# EasyEDA Pro project SylvaEcho_rev0.3.epro

# Schematic sylvaecho

## Sheets
1 1 Power, MCU & LoRa Radio: Board Name: sylvaecho; Create Date: 2026-11-25; Page Name: 1 Power, MCU & LoRa Radio; Project Name: SylvaEcho: Solar LoRa Tree Sensor for Pollinators and Illegal Logging; Schematic Name: sylvaecho; Update Date: 2026-11-25; Company: SylvaEcho - open hardware; Page Size: A3; Version: Rev 0.3
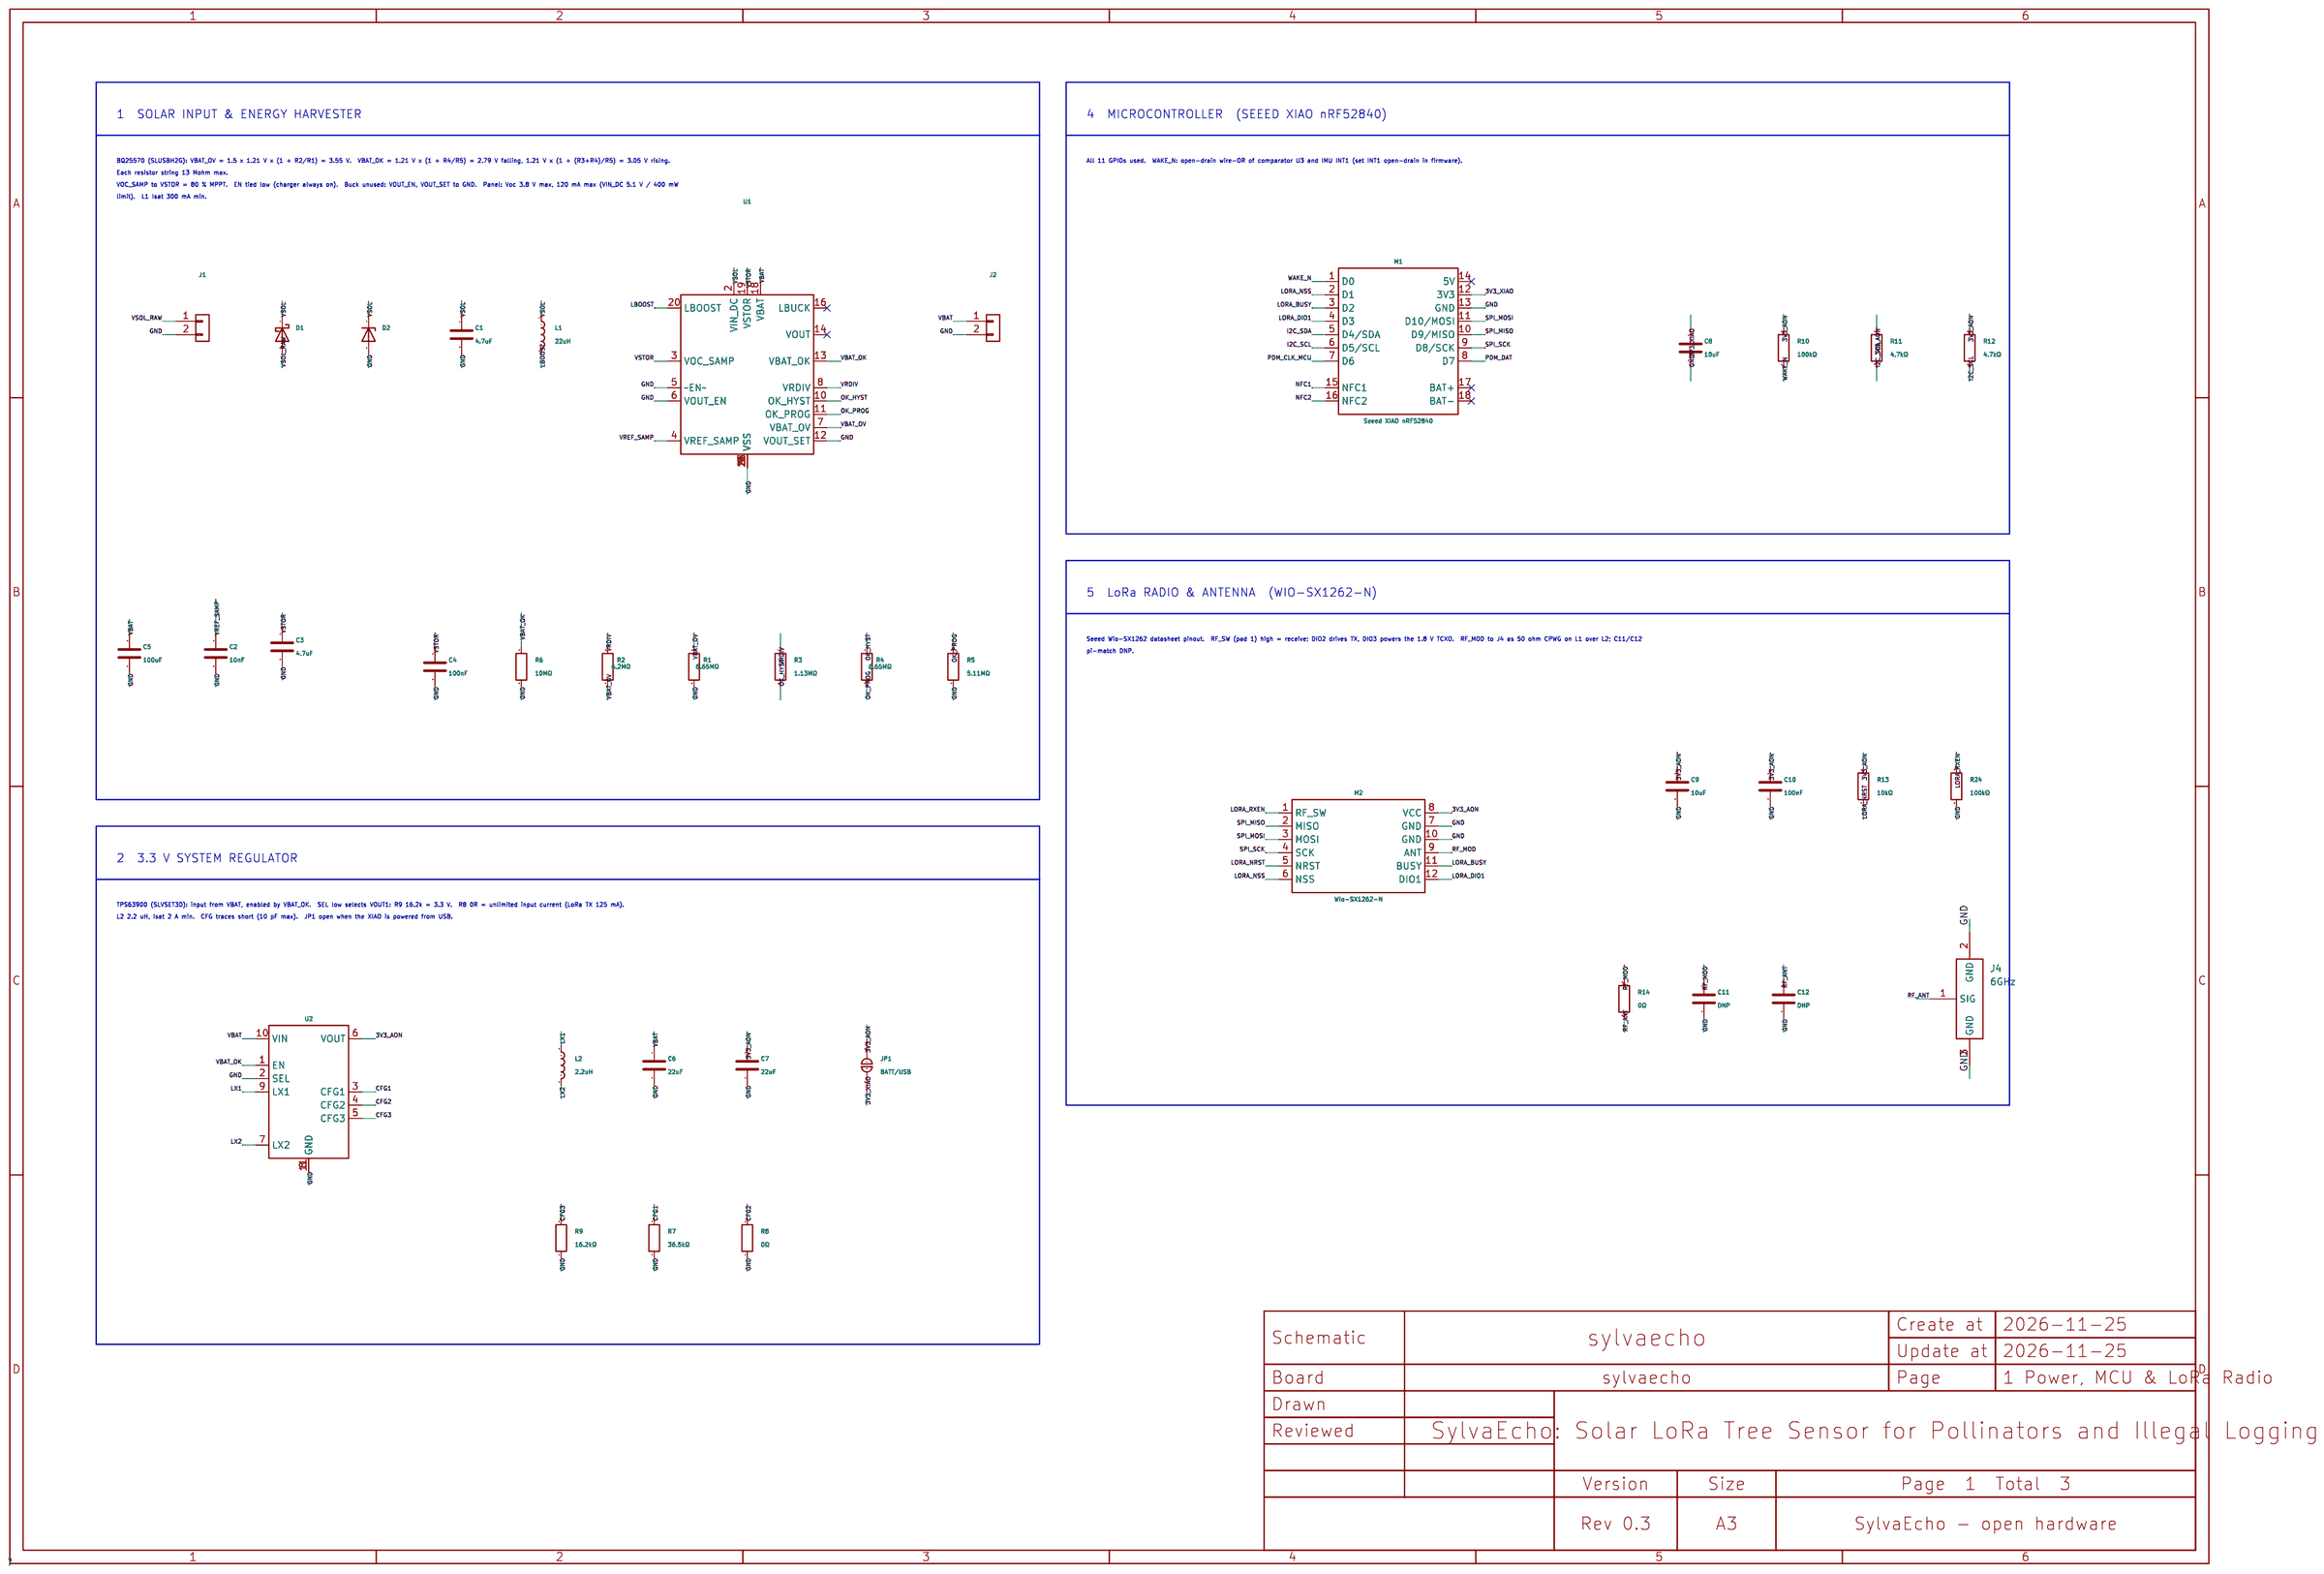
[diagram p0: 1 Power, MCU & LoRa Radio]
2 2 Sensors, Wake & IO: Page Name: 2 Sensors, Wake & IO
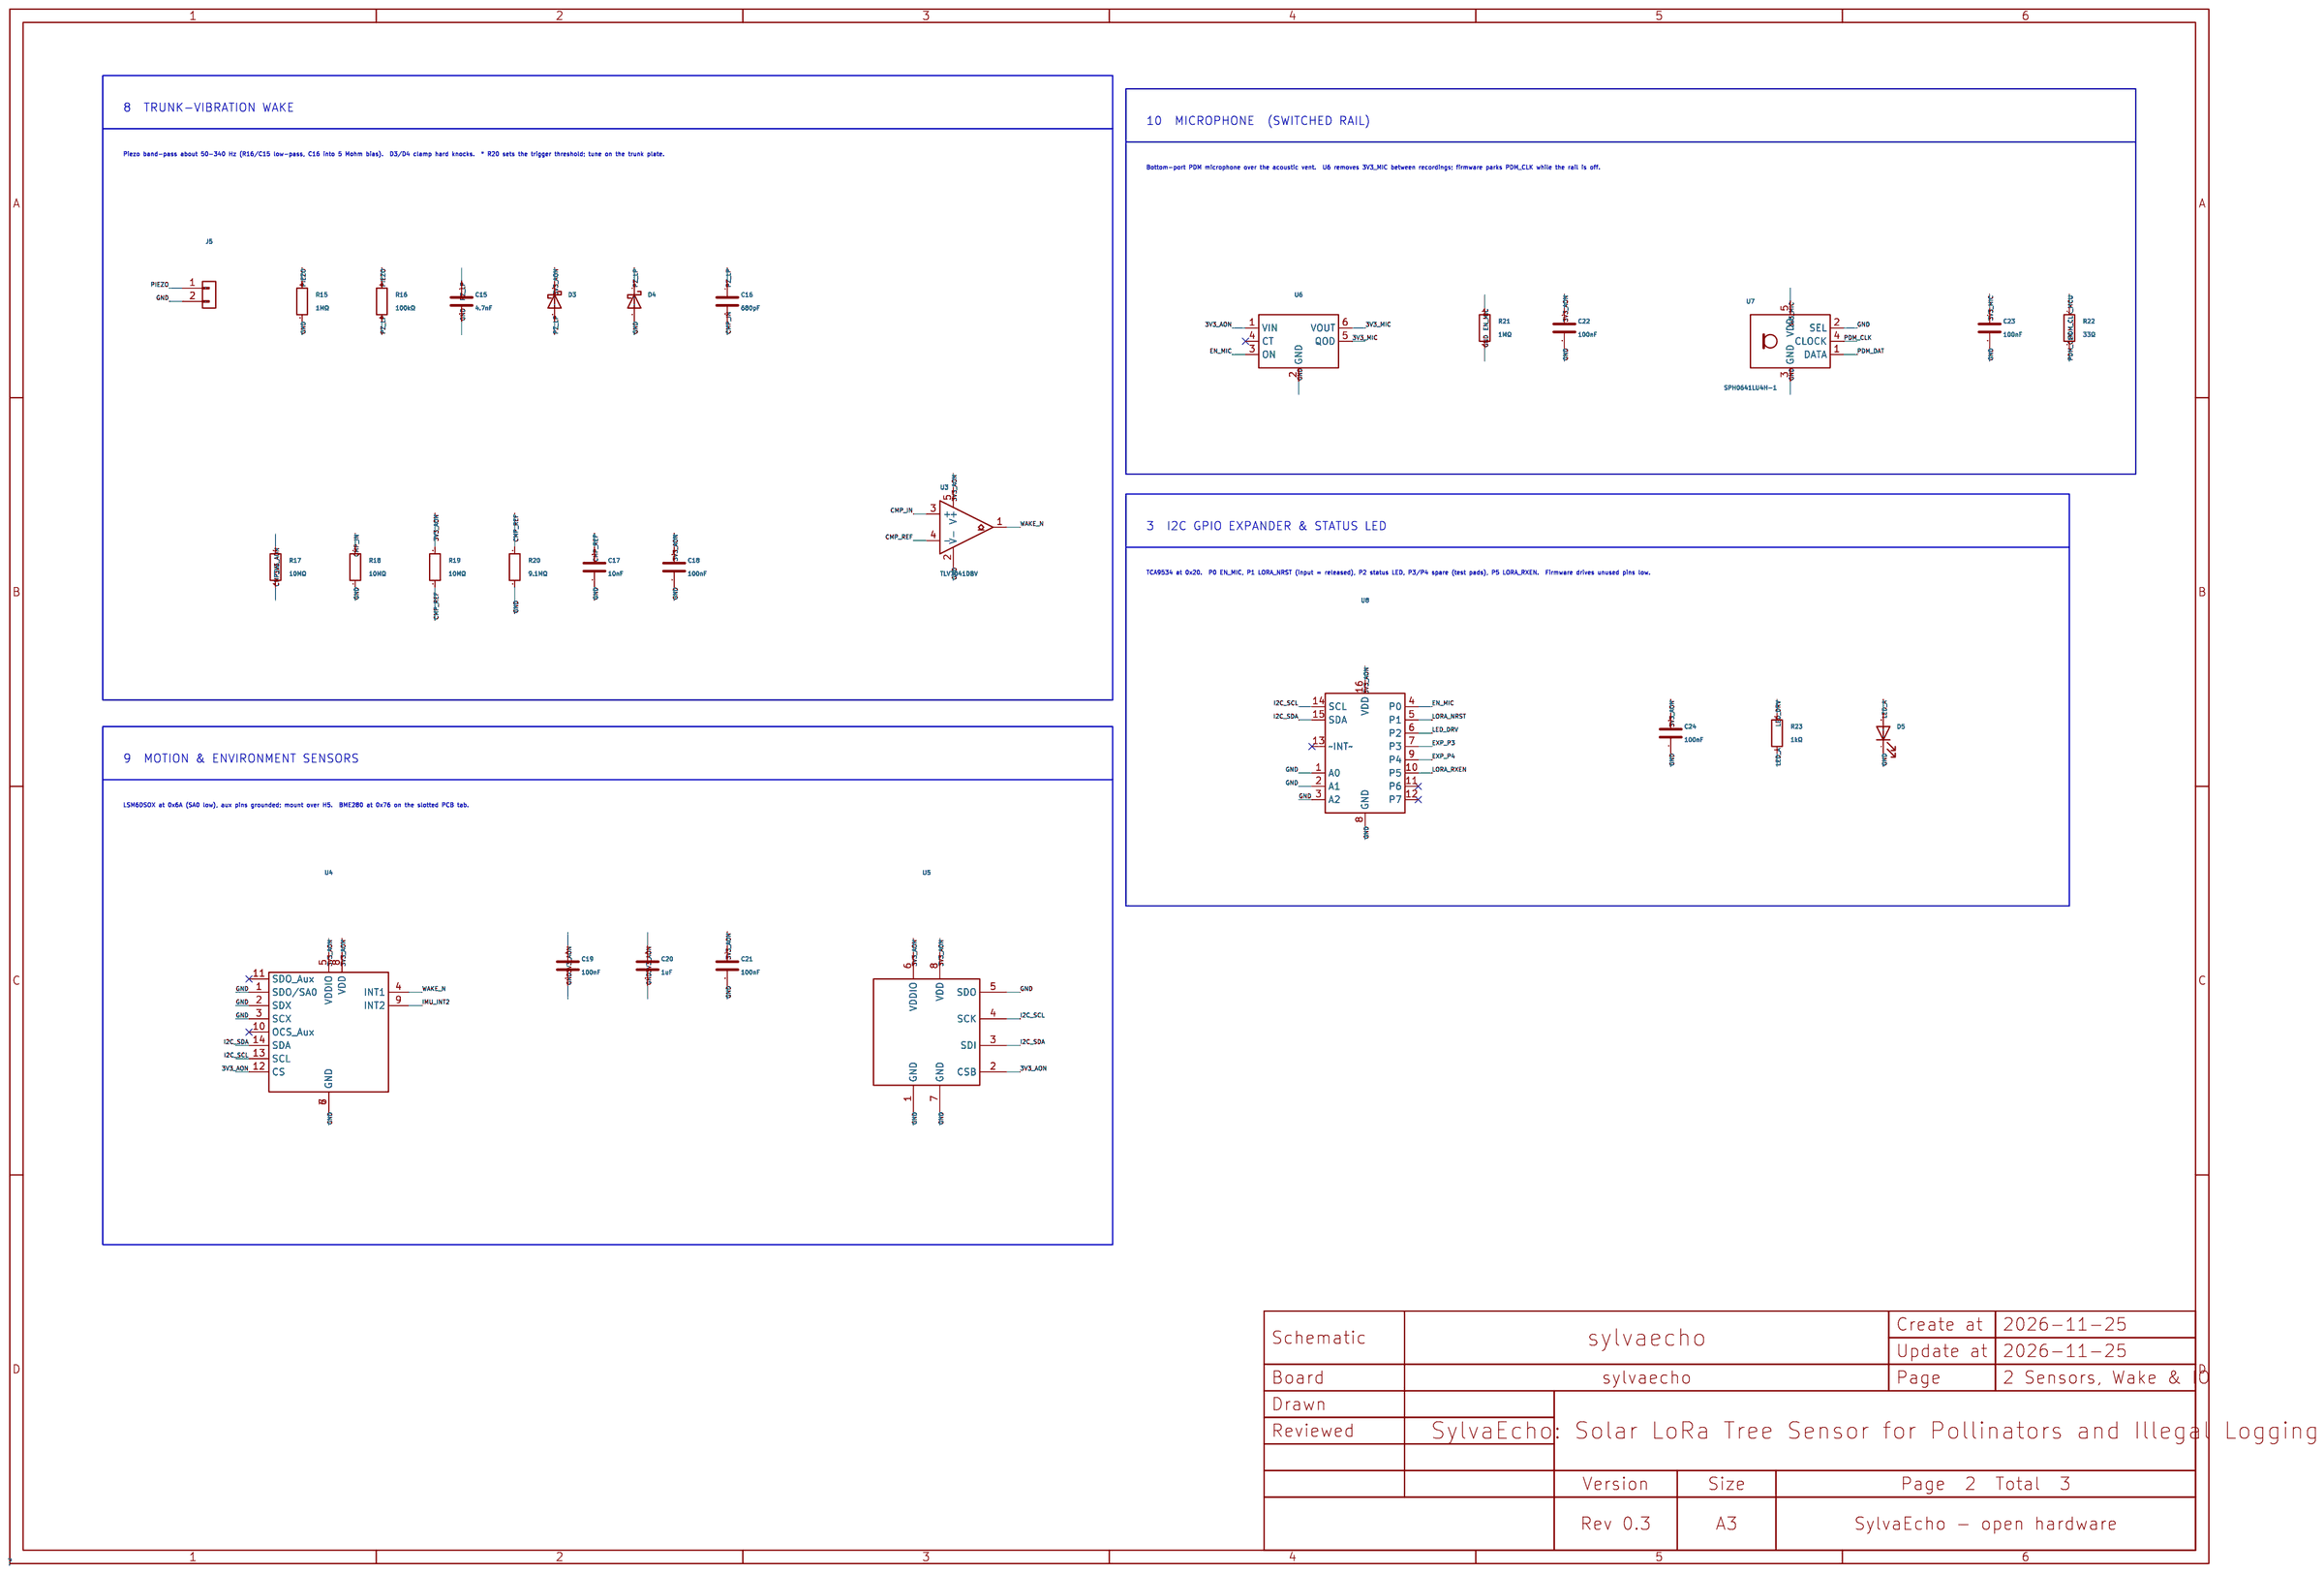
[diagram p1: 2 Sensors, Wake & IO]
3 3 NFC, Expansion & Test: Create Date: 2026-11-24; Page Name: 3 NFC, Expansion & Test; Update Date: 2026-11-24
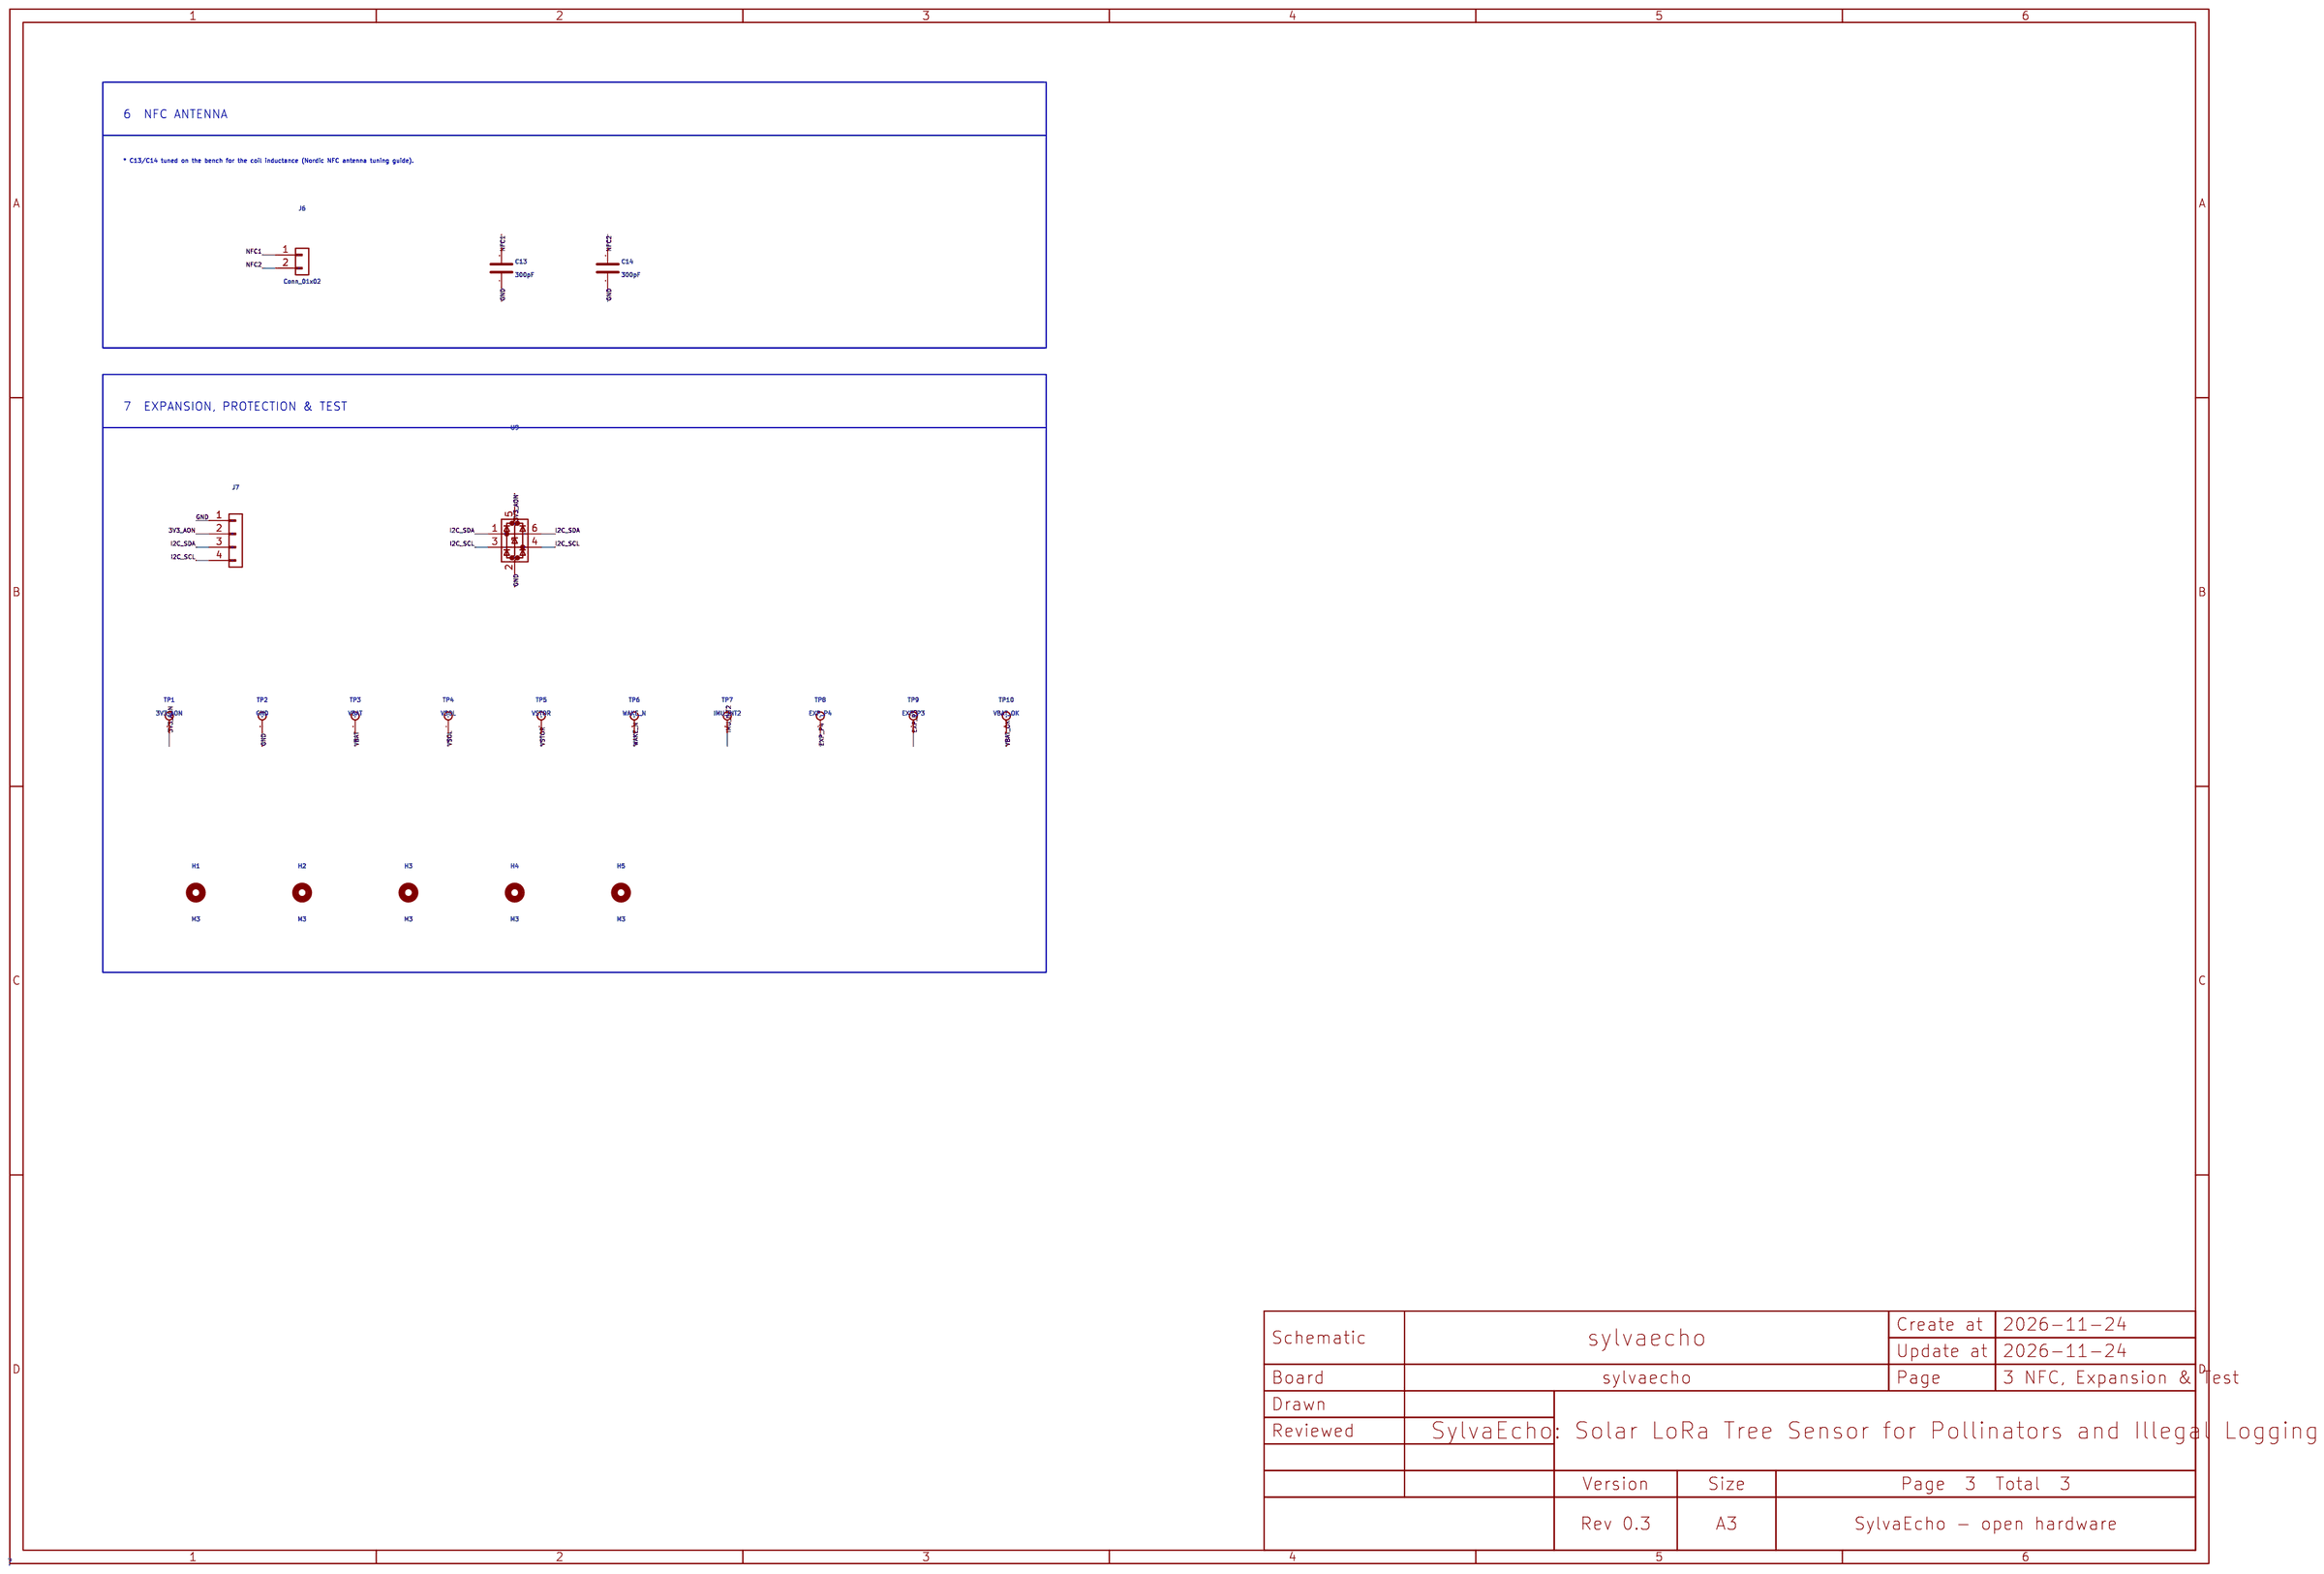
[diagram p2: 3 NFC, Expansion & Test]

## Parts
sheet 1 Power, MCU & LoRa Radio
C1  4.7uF
C2  10nF
C3  4.7uF
C4  100nF
C5  100uF
C6  22uF
C7  22uF
C8  10uF
C9  10uF
C10  100nF
C11  DNP
C12  DNP
D1  -
D2  -
J1  -
J2  -
J4  6GHz  [RF-SMD_FRF05002-JSS103M]
JP1  BATT/USB
L1  22uH
L2  2.2uH
M1  Seeed XIAO nRF52840
M2  Wio-SX1262-N
R1  6.65MΩ
R2  6.2MΩ
R3  1.13MΩ
R4  6.65MΩ
R5  5.11MΩ
R6  10MΩ
R7  36.5kΩ
R8  0Ω
R9  16.2kΩ
R10  100kΩ
R11  4.7kΩ
R12  4.7kΩ
R13  10kΩ
R14  0Ω
R24  100kΩ
U1  -
U2  -
sheet 2 Sensors, Wake & IO
C15  4.7nF
C16  680pF
C17  10nF
C18  100nF
C19  100nF
C20  1uF
C21  100nF
C22  100nF
C23  100nF
C24  100nF
D3  -
D4  -
D5  -
J5  -
R15  1MΩ
R16  100kΩ
R17  10MΩ
R18  10MΩ
R19  10MΩ
R20  9.1MΩ
R21  1MΩ
R22  33Ω
R23  1kΩ
U3  TLV7041DBV
U4  -
U5  -
U6  -
U7  SPH0641LU4H-1
U8  -
sheet 3 NFC, Expansion & Test
C13  300pF
C14  300pF
H1  M3
H2  M3
H3  M3
H4  M3
H5  M3
J6  Conn_01x02
J7  -
TP1  3V3_AON
TP2  GND
TP3  VBAT
TP4  VSOL
TP5  VSTOR
TP6  WAKE_N
TP7  IMU_INT2
TP8  EXP_P4
TP9  EXP_P3
TP10  VBAT_OK
U9  -

## Library data of the parts
C1 C3 = Device_C: Capacitance:4.7uF Tolerance:±10% Tolerance:±10% Voltage Rating:16V Temperature Coefficient:X5R
C2 = Device_C: Capacitance: Tolerance:±5% Tolerance:±5% Voltage Rated: Temperature Coefficient:
C4 C10 C18 C19 C21-C24 = Device_C: Capacitance:100nF Tolerance:±10% Tolerance:±10% Voltage Rating:16V Temperature Coefficient:X7R
C5 = Device_C: Capacitance:100uF Tolerance:±20% Tolerance:±20% Voltage Rating:6.3V Temperature Coefficient:X5R
C6 C7 = Device_C: Capacitance:22uF Tolerance:±20% Tolerance:±20% Voltage Rating:25V Temperature Coefficient:X5R
C8 C9 = Device_C: Capacitance:10uF Tolerance:±20% Tolerance:±20% Voltage Rating:6.3V Temperature Coefficient:X5R
C11 C12 = Device_C: LCSC Part Name: 680pF ±5% 50V; Supplier Part: C307451; Manufacturer: SAMSUNG(三星); Manufacturer Part: CL05C681JB5NNNC; Supplier Footprint: 0402; JLCPCB Part Class: Extended Part; Datasheet: https://item.szlcsc.com/datasheet/CL05C681JB5NNNC/291125.html; Supplier: LCSC; Tolerance: ±5%; Voltage Rating: 50V; Temperature Coefficient: C0G
D1 = Device_D_Schottky: Voltage - Forward(Vf@If):600mV@1A Voltage - DC Reverse(Vr):40V Current - Rectified:1A Non-Repetitive Peak Forward Surge Current:9A
D2 = Device_D_Zener: Diode Configuration:1 Independent Zener Voltage(Nom):4.7V Reverse Leakage Current (Ir):3uA Zener Voltage(Range):4.47V~4.94V Zener Voltage(Range):4.47V~4.94V Pd - Power Dissipation:350mW Impedance(Zzt):80Ω Impedance(Zzk):500Ω Operating Junction Temperature
J1 J2 J5 = Connector_Generic_Conn_01x02: Pins Structure:1x2P Pitch:2mm Mounting Type:Surface Mount, Right Angle Reference Series:PH Number of Pins:2P Number of Rows:1 Number of PINs Per Row:2 Row Spacing:- Current Rating:2A Contact Material:Copper alloy Contact Plating:Tin Operating Temperature:
J4 = U.FL-R-SMT-1(80)_C88374: Connector Type:Board Side Interface:Inner pin Number of Ports:1 Interface Diameter:2mm Interface Length/Height:1.25mm Frequency:6GHz RF Series:IPEX Impedance:50Ω Style:- Operating Temperature Range:-40℃~+90℃ Operating Temperature Range:-40℃~+90℃; LCSC Part Name: IPEX 内针; Supplier Part: C88374; Manufacturer: HRS(广濑); Manufacturer Part: U.FL-R-SMT-1(80); Supplier Footprint: SMD; JLCPCB Part Class: Extended Part; Datasheet: https://item.szlcsc.com/datasheet/U.FL-R-SMT-1(80)/89553.html; Supplier: LCSC; Connector Type: Board Side; Interface: Inner pin; Number of Ports: 1; Interface Diameter: 2mm; Interface Length/Height: 1.25mm; RF Series: IPEX; Impedance: 50Ω; Operating Temperature Range: -40℃~+90℃; PCB Layer: Default
JP1 = Jumper_SolderJumper_2_Open
L1 = Device_L: Inductance:22uH Tolerance:±20% Tolerance:±20% Current Rating:950mA Current - Saturation(Isat):880mA DC Resistance(DCR):350mΩ Type:Magnetic Shielded Inductor Magnetic Core:Ferrite Application Grade:Consumer grade
L2 = Device_L: Inductance:2.2uH Tolerance:±20% Tolerance:±20% Current Rating:2.6A Current - Saturation(Isat):3.2A Type:Magnetic Shielded Inductor Application Grade:Consumer grade
M1 = SylvaEcho_XIAO_nRF52840
M2 = SylvaEcho_Wio_SX1262_SMT
R1 R4 = Device_R: Type:Thick Film Resistors Resistance: Tolerance:±1% Tolerance:±1% Power(Watts): Overload Voltage (Max): Temperature Coefficient:±100ppm/℃ Temperature Coefficient:±100ppm/℃ Operating Temperature Range:-55℃~+155℃ Operating Temperature Range:-55℃~+155℃; LCSC Part Name: 厚膜电阻 6.65MΩ ±1% 62.5mW; Supplier Part: C620472; Manufacturer: UNI-ROYAL(厚声); Manufacturer Part: 0402WGF6654TCE; Supplier Footprint: 0402; JLCPCB Part Class: Extended Part; Datasheet: https://atta.szlcsc.com/upload/public/pdf/source/20200715/C477773_612125B6565291B8A455FD85854881BB.pdf; Supplier: LCSC; Type: Thick Film Resistors; Tolerance: ±1%; Temperature Coefficient: ±100ppm/℃; Operating Temperature Range: -55℃~+155℃; PCB Layer: Default
R2 = Device_R: Type:Thick Film Resistor Resistance:6.34MΩ Tolerance:±1% Tolerance:±1% Power(Watts):62.5mW Voltage-Supply(Max):50V Temperature Coefficient:±100ppm/℃ Temperature Coefficient:±100ppm/℃ Operating Temperature:-55℃~+155℃ Operating Temperature:-55℃~+155℃; LCSC Part Name: 厚膜电阻 6.34MΩ ±1% 62.5mW; Supplier Part: C166436; Manufacturer: RALEC(旺诠); Manufacturer Part: RTT026204FTH; Supplier Footprint: 0402; JLCPCB Part Class: Extended Part; Datasheet: https://item.szlcsc.com/datasheet/RC0402FR-076M34L/484702.html; Supplier: LCSC; Type: Thick Film Resistor; Tolerance: ±1%; Power(Watts): 62.5mW; Voltage-Supply(Max): 50V; Temperature Coefficient: ±100ppm/℃; Operating Temperature: -55℃~+155℃; PCB Layer: Default
R3 = Device_R: Type:Thick Film Resistor Resistance:1.13MΩ Tolerance:±1% Tolerance:±1% Power(Watts):62.5mW Voltage-Supply(Max):50V Temperature Coefficient:±100ppm/℃ Temperature Coefficient:±100ppm/℃ Operating Temperature:-55℃~+155℃ Operating Temperature:-55℃~+155℃
R5 R20 = Device_R: Type:Thick Film Resistors Resistance: Tolerance:±1% Tolerance:±1% Power(Watts): Overload Voltage (Max): Temperature Coefficient:±100ppm/℃ Temperature Coefficient:±100ppm/℃ Operating Temperature Range:-55℃~+155℃ Operating Temperature Range:-55℃~+155℃
R6 R17-R19 = Device_R: Type:Thick Film Resistor Resistance:10MΩ Tolerance:±1% Tolerance:±1% Power(Watts):62.5mW Voltage-Supply(Max):50V Temperature Coefficient:±200ppm/℃ Temperature Coefficient:±200ppm/℃ Operating Temperature:-55℃~+155℃ Operating Temperature:-55℃~+155℃
R7 = Device_R: Type:Thick Film Resistor Resistance:36.5kΩ Tolerance:±1% Tolerance:±1% Power(Watts):62.5mW Voltage-Supply(Max):50V Temperature Coefficient:±100ppm/℃ Temperature Coefficient:±100ppm/℃ Operating Temperature:-55℃~+155℃ Operating Temperature:-55℃~+155℃
R8 R14 = Device_R: Type:Thick Film Resistor Resistance:0Ω Tolerance:±1% Tolerance:±1% Power(Watts):62.5mW Voltage-Supply(Max):50V Temperature Coefficient:±800ppm/℃ Temperature Coefficient:±800ppm/℃ Operating Temperature:-55℃~+155℃ Operating Temperature:-55℃~+155℃
R9 = Device_R: Type:Thick Film Resistor Resistance:16.2kΩ Tolerance:±1% Tolerance:±1% Power(Watts):62.5mW Voltage-Supply(Max):50V Temperature Coefficient:±100ppm/℃ Temperature Coefficient:±100ppm/℃ Operating Temperature:-55℃~+155℃ Operating Temperature:-55℃~+155℃
R10 R16 R24 = Device_R: Type:Thick Film Resistor Resistance:100kΩ Tolerance:±1% Tolerance:±1% Power(Watts):62.5mW Voltage-Supply(Max):50V Temperature Coefficient:±100ppm/℃ Temperature Coefficient:±100ppm/℃ Operating Temperature:-55℃~+155℃ Operating Temperature:-55℃~+155℃
R11 R12 = Device_R: Type:Thick Film Resistor Resistance:4.7kΩ Tolerance:±1% Tolerance:±1% Power(Watts):62.5mW Voltage-Supply(Max):50V Temperature Coefficient:±100ppm/℃ Temperature Coefficient:±100ppm/℃ Operating Temperature:-55℃~+155℃ Operating Temperature:-55℃~+155℃
R13 = Device_R: Type:Thick Film Resistor Resistance:10kΩ Tolerance:±1% Tolerance:±1% Power(Watts):62.5mW Voltage-Supply(Max):50V Temperature Coefficient:±100ppm/℃ Temperature Coefficient:±100ppm/℃ Operating Temperature:-55℃~+155℃ Operating Temperature:-55℃~+155℃
U1 = Battery_Management_BQ25570: The Chip Type:Protection IC；Charging IC Voltage - Supply:2V~5.5V Voltage - Supply:2V~5.5V Charge Current - Max:285mA End-Off Voltage:1.95V Type of Battery:Supercapacitor；Lithium Battery Operating Temperature:-40℃~+125℃ Operating Temperature:-40℃~+125℃ Bat
U2 = Regulator_Switching_TPS63900: Function:Buck-Boost Voltage - Supply:1.8V~5.5V Voltage - Supply:1.8V~5.5V Output Voltage:1.8V~5V Output Voltage:1.8V~5V Output Current:400mA Frequency - Switching:- Frequency - Switching:- Operating Temperature:-40℃~+125℃@(TJ) Operating Temperature:-40℃~+
C15 = Device_C: Capacitance:4.7nF Tolerance:±10% Tolerance:±10% Voltage Rating:50V Temperature Coefficient:X7R
C16 = Device_C: Capacitance:680pF Tolerance:±5% Tolerance:±5% Voltage Rating:50V Temperature Coefficient:C0G
C17 = Device_C: Capacitance:10nF Tolerance:±10% Tolerance:±10% Voltage Rating:50V Temperature Coefficient:X7R
C20 = Device_C: Capacitance:1uF Tolerance:±10% Tolerance:±10% Voltage Rating:25V Temperature Coefficient:X5R
D3 D4 = Device_D_Schottky: Diode Configuration:1 Independent Voltage - Forward(Vf@If):1V@100mA Voltage - DC Reverse(Vr):30V Current - Rectified:100mA Reverse Leakage Current (Ir):2uA@25V Operating Junction Temperature Range:-65℃~+150℃ Operating Junction Temperature Range:-65℃~+150℃
D5 = Device_LED: Lamp Holder Type:1.6mm x 0.8mm square LED Illumination Color:Emerald Green Voltage - Forward(Vf):3.1V Voltage - Forward(Vf):3.1V Power(Watts):100mW Forward Current:5mA Wavelength - Dominant:513nm~528nm Wavelength - Dominant:513nm~528nm Peak Wavelength:525
R15 R21 = Device_R: Type:Thick Film Resistor Resistance:1MΩ Tolerance:±1% Tolerance:±1% Power(Watts):62.5mW Voltage-Supply(Max):50V Temperature Coefficient:±100ppm/℃ Temperature Coefficient:±100ppm/℃ Operating Temperature:-55℃~+155℃ Operating Temperature:-55℃~+155℃
R22 = Device_R: Type:Thick Film Resistor Resistance:33Ω Tolerance:±1% Tolerance:±1% Power(Watts):62.5mW Voltage-Supply(Max):50V Temperature Coefficient:±100ppm/℃ Temperature Coefficient:±100ppm/℃ Operating Temperature:-55℃~+155℃ Operating Temperature:-55℃~+155℃
R23 = Device_R: Type:Thick Film Resistor Resistance:1kΩ Tolerance:±1% Tolerance:±1% Power(Watts):62.5mW Voltage-Supply(Max):50V Temperature Coefficient:±100ppm/℃ Temperature Coefficient:±100ppm/℃ Operating Temperature:-55℃~+155℃ Operating Temperature:-55℃~+155℃
U3 = Comparator_TLV7041DBV: Number of Channels:Single-channel Vos - Input Offset Voltage:100uV Ib - Input Bias Current:2pA Propagation Delay Time:3us Input Hysteresis Voltage (Vhys):7mV Common Mode Rejection Ratio(CMRR):73dB Output Type:Open-drain Output Mode:- Rail to Rail:Rail-to-; UserDocLink: https://www.ti.com/lit/ds/symlink/tlv7041.pdf; LCSC Part Name: 小尺寸、毫微功耗、低电压比较器; Supplier Part: C3659207; Manufacturer: TI(德州仪器); Manufacturer Part: TLV7041QDBVRQ1; Supplier Footprint: SOT-23-5; JLCPCB Part Class: Extended Part; Datasheet: https://www.ti.com/cn/lit/ds/symlink/tlv7042.pdf; Supplier: LCSC; Number of Channels: Single-channel; Vos - Input Offset Voltage: 100uV; Ib - Input Bias Current: 2pA; Propagation Delay Time: 3us; Input Hysteresis Voltage (Vhys): 7mV; Common Mode Rejection Ratio(CMRR): 73dB; Output Type: Open-drain; Rail to Rail: Rail-to-rail input; Quiescent Current: 315nA; Operating Temperature: -40℃~+125℃; Maximum Power Supply Range (Vdd-Vss): 7V; Single Supply: 1.6V~6.5V; Input Offset Current(Ios): 1pA; Response Time (tr): 4.5ns; PCB Layer: Default
U4 = Sensor_Motion_LSM6DSM: Accelerometer Sensing Axis:X,Y,Z Acceleration Measurement Range (MAX):±16g Acceleration Measurement Range (MAX):±16g Gyroscope Sensing Axis:X,Y,Z Gyroscope Measurement Range (MAX):±2000dps Gyroscope Measurement Range (MAX):±2000dps Sensor Type:IMU (accele
U5 = Sensor_BME280: Temperature Range:-40℃~+85℃ Temperature Range:-40℃~+85℃ Humidity:0%RH~100%RH Humidity:0%RH~100%RH Interface:I2C；SPI Voltage - Supply:1.71V~3.6V Voltage - Supply:1.71V~3.6V Current - Supply:1.8uA Humidity Tolerance:±3%RH Humidity Tolerance:±3%RH Temperatur
U6 = Power_Management_TPS22917DBV: Type:Load Switch Number of Channels:1 Control Input Logic:Active High Voltage - Supply:0V~5.5V Voltage - Supply:0V~5.5V Maximum Continuous Current:2A RDS(on):80mΩ Features:Soft-start；Reverse current blocking；Output discharge function Operating Temperature
U7 = Sensor_Audio_SPH0641LU4H-1: Manufacturer: Knowles(楼氏); Supplier: LCSC; Supplier Part: C2879853; PCB Layer: Default
U8 = Interface_Expansion_TCA9534: Interface:I2C Number of I/O:8 Interrupt Output:Interrupt Output Output Type:Push-Pull Current - Output Low(IOL):25mA Current - Output High(IOH):10mA Clock Frequency:400kHz Number of Supporting Devices:8 Quiescent Supply Current:1.5uA Output Logic Level -
C13 C14 = Device_C: Capacitance:300pF Tolerance:±5% Tolerance:±5% Voltage Rating:50V Temperature Coefficient:C0G; PCB Layer: Default; LCSC Part Name: 300pF ±5% 50V; Supplier Part: C162095; Manufacturer: muRata(村田); Manufacturer Part: GRM1555C1H301JA01D; Supplier Footprint: 0402; JLCPCB Part Class: Extended Part; Datasheet: https://item.szlcsc.com/datasheet/GRM1555C1H301JA01D/173476.html; Supplier: LCSC; Tolerance: ±5%; Voltage Rating: 50V; Temperature Coefficient: C0G
H1-H5 = Mechanical_MountingHole
J6 = Connector_Generic_Conn_01x02: Pins Structure:1x2P Pitch:2mm Mounting Type:Surface Mount, Right Angle Reference Series:PH Number of Pins:2P Number of Rows:1 Number of PINs Per Row:2 Row Spacing:- Current Rating:2A Contact Material:Copper alloy Contact Plating:Tin Operating Temperature:; PCB Layer: Default; LCSC Part Name: 1x2P 间距:2mm 卧贴 系列:PH; Supplier Part: C295747; Manufacturer: JST; Manufacturer Part: S2B-PH-SM4-TB(LF)(SN); Supplier Footprint: SMD,P=2mm,卧贴; JLCPCB Part Class: Extended Part; Datasheet: https://item.szlcsc.com/datasheet/S2B-PH-SM4-TB(LF)(SN)/280164.html; Supplier: LCSC; Pins Structure: 1x2P; Pitch: 2mm; Mounting Type: Surface Mount, Right Angle; Reference Series: PH; Number of Pins: 2P; Number of Rows: 1; Number of PINs Per Row: 2; Current Rating: 2A; Contact Material: Copper alloy; Contact Plating: Tin; Operating Temperature: -25℃~+85℃; Voltage Rating: 100V; Plastic Material: PA; Flame Retardant Rating: UL94V-0; Supplementary Features: Auxiliary Solder Pin; Color: Beige; Z-Height of the Board: 5.5mm; X-Length of Bottom Edge on Board (Spacing Line): 7.9mm; Y-Width of Bottom Edge on Board: 8.6mm
J7 = Connector_Generic_Conn_01x04: Pins Structure:1x4P Pitch:1mm Mounting Type:Surface Mount, Right Angle Reference Series:SH Number of Pins:4P Number of Rows:1 Number of PINs Per Row:4 Row Spacing:- Current Rating:1A Contact Material:Copper alloy Contact Plating:Tin Operating Temperature:
TP1-TP10 = Connector_TestPoint
U9 = Power_Protection_USBLC6-2SC6: Polarity:Unidirectional Reverse Stand-Off Voltage (Vrwm):5V Clamping Voltage:12V Peak Pulse Current (Ipp):6A Peak Pulse Power Dissipation (Ppp):150W Voltage - Breakdown:6V Reverse Leakage Current (Ir):80nA Number of Channels:2 Operating Temperature:-55℃~+

## Nets
3V3_AON: C7.1 C9.1 C10.1 C18.1 C19.1 C20.1 C21.1 C22.1 C24.1 D3.1(K) J7.2(Pin) JP1.1(A) M2.8(VCC) R10.1 R11.1 R12.1 R13.1 R17.1 R19.1 TP1.1 U2.6(VOUT) U3.5(V+) U4.5(VDDIO) U4.8(VDD) U4.12(CS) U5.2(CSB) U5.6(VDDIO) U5.8(VDD) U6.1(VIN) U8.16(VDD) U9.5(VBUS)
3V3_MIC: C23.1 U6.5(QOD) U6.6(VOUT) U7.5(VDD)
3V3_XIAO: C8.1 JP1.2(B) M1.12(3V3)
GND: C1.2 C2.2 C3.2 C4.2 C5.2 C6.2 C7.2 C8.2 C9.2 C10.2 C11.2 C12.2 C13.2 C14.2 C15.2 C17.2 C18.2 C19.2 C20.2 C21.2 C22.2 C23.2 C24.2 D2.2(A) D4.2(A) D5.1(K) J1.2(Pin) J2.2(Pin) J4.2(GND) J4.3(GND) J5.2(Pin) J7.1(Pin) M1.13(GND) M2.7(GND) M2.10(GND) R1.2 R5.2 R6.2 R7.2 R8.2 R9.2 R15.2 R18.2 R20.2 R21.2 R24.2 TP2.1 U1.1(VSS) U1.5(~EN~) U1.6(VOUT_EN) U1.9(VSS) U1.12(VOUT_SET) U1.15(VSS) U1.17(VSS) U1.21(VSS) U2.2(SEL) U2.8(GND) U2.11(GND) U3.2(V-) U4.1(SDO/SA0) U4.2(SDX) U4.3(SCX) U4.6(GND) U4.7(GND) U5.1(GND) U5.5(SDO) U5.7(GND) U6.2(GND) U7.2(SEL) U7.3(GND) U8.1(A0) U8.2(A1) U8.3(A2) U8.8(GND) U9.2(GND)
VBAT: C5.1 C6.1 J2.1(Pin) TP3.1 U1.18(VBAT) U2.10(VIN)
VBAT_OK: R6.1 TP10.1 U1.13(VBAT_OK) U2.1(EN)
VBAT_OV: R1.1 R2.2 U1.7(VBAT_OV)
CFG1: R7.1 U2.3(CFG1)
CFG2: R8.1 U2.4(CFG2)
CFG3: R9.1 U2.5(CFG3)
CMP_IN: C16.2 R17.2 R18.1 U3.3(+)
CMP_REF: C17.1 R19.2 R20.1 U3.4(-)
EN_MIC: R21.1 U6.3(ON) U8.4(P0)
EXP_P3: TP9.1 U8.7(P3)
EXP_P4: TP8.1 U8.9(P4)
I2C_SCL: J7.4(Pin) M1.6(D5/SCL) R12.2 U4.13(SCL) U5.4(SCK) U8.14(SCL) U9.3(I/O2) U9.4(I/O2)
I2C_SDA: J7.3(Pin) M1.5(D4/SDA) R11.2 U4.14(SDA) U5.3(SDI) U8.15(SDA) U9.1(I/O1) U9.6(I/O1)
IMU_INT2: TP7.1 U4.9(INT2)
LBOOST: L1.2 U1.20(LBOOST)
LED_A: D5.2(A) R23.2
LED_DRV: R23.1 U8.6(P2)
LORA_BUSY: M1.3(D2) M2.11(BUSY)
LORA_DIO1: M1.4(D3) M2.12(DIO1)
LORA_NRST: M2.5(NRST) R13.2 U8.5(P1)
LORA_NSS: M1.2(D1) M2.6(NSS)
LORA_RXEN: M2.1(RF_SW) R24.1 U8.10(P5)
LX1: L2.1 U2.9(LX1)
LX2: L2.2 U2.7(LX2)
NFC1: C13.1 J6.1(Pin) M1.15(NFC1)
NFC2: C14.1 J6.2(Pin) M1.16(NFC2)
OK_HYST: R3.2 R4.1 U1.10(OK_HYST)
OK_PROG: R4.2 R5.1 U1.11(OK_PROG)
PDM_CLK: R22.2 U7.4(CLOCK)
PDM_CLK_MCU: M1.7(D6) R22.1
PDM_DAT: M1.8(D7) U7.1(DATA)
PIEZO: J5.1(Pin) R15.1 R16.1
PZ_LP: C15.1 C16.1 D3.2(A) D4.1(K) R16.2
RF_ANT: C12.1 J4.1(SIG) R14.2
RF_MOD: C11.1 M2.9(ANT) R14.1
SPI_MISO: M1.10(D9/MISO) M2.2(MISO)
SPI_MOSI: M1.11(D10/MOSI) M2.3(MOSI)
SPI_SCK: M1.9(D8/SCK) M2.4(SCK)
VRDIV: R2.1 R3.1 U1.8(VRDIV)
VREF_SAMP: C2.1 U1.4(VREF_SAMP)
VSOL: C1.1 D1.1(K) D2.1(K) L1.1 TP4.1 U1.2(VIN_DC)
VSOL_RAW: D1.2(A) J1.1(Pin)
VSTOR: C3.1 C4.1 TP5.1 U1.3(VOC_SAMP) U1.19(VSTOR)
WAKE_N: M1.1(D0) R10.2 TP6.1 U3.1 U4.4(INT1)

Not connected (* = marked no-connect by the designer): M1 14(5V)* 17(BAT+)* 18(BAT-)*; U1 14(VOUT)* 16(LBUCK)*; U4 10(OCS_Aux)* 11(SDO_Aux)*; U6 4(CT)*; U8 11(P6)* 12(P7)* 13(~INT~)*

## Notes on the sheets
sheet 1
- 1  SOLAR INPUT & ENERGY HARVESTER
- 4  MICROCONTROLLER  (SEEED XIAO nRF52840)
- BQ25570 (SLUSBH2G): VBAT_OV = 1.5 x 1.21 V x (1 + R2/R1) = 3.55 V.  VBAT_OK = 1.21 V x (1 + R4/R5) = 2.79 V falling, 1.21 V x (1 + (R3+R4)/R5) = 3.05 V rising.
- Each resistor string 13 Mohm max.
- All 11 GPIOs used.  WAKE_N: open-drain wire-OR of comparator U3 and IMU INT1 (set INT1 open-drain in firmware).
- VOC_SAMP to VSTOR = 80 % MPPT.  EN tied low (charger always on).  Buck unused: VOUT_EN, VOUT_SET to GND.  Panel: Voc 3.8 V max, 120 mA max (VIN_DC 5.1 V / 400 mW
- limit).  L1 Isat 300 mA min.
- 5  LoRa RADIO & ANTENNA  (WIO-SX1262-N)
- Seeed Wio-SX1262 datasheet pinout.  RF_SW (pad 1) high = receive; DIO2 drives TX, DIO3 powers the 1.8 V TCXO.  RF_MOD to J4 as 50 ohm CPWG on L1 over L2; C11/C12
- pi-match DNP.
- 2  3.3 V SYSTEM REGULATOR
- TPS63900 (SLVSET3D): input from VBAT, enabled by VBAT_OK.  SEL low selects VOUT1: R9 16.2k = 3.3 V.  R8 0R = unlimited input current (LoRa TX 125 mA).
- L2 2.2 uH, Isat 2 A min.  CFG traces short (10 pF max).  JP1 open when the XIAO is powered from USB.
sheet 2
- 8  TRUNK-VIBRATION WAKE
- 10  MICROPHONE  (SWITCHED RAIL)
- Piezo band-pass about 50-340 Hz (R16/C15 low-pass, C16 into 5 Mohm bias).  D3/D4 clamp hard knocks.  * R20 sets the trigger threshold; tune on the trunk plate.
- Bottom-port PDM microphone over the acoustic vent.  U6 removes 3V3_MIC between recordings; firmware parks PDM_CLK while the rail is off.
- 3  I2C GPIO EXPANDER & STATUS LED
- TCA9534 at 0x20.  P0 EN_MIC, P1 LORA_NRST (input = released), P2 status LED, P3/P4 spare (test pads), P5 LORA_RXEN.  Firmware drives unused pins low.
- 9  MOTION & ENVIRONMENT SENSORS
- LSM6DSOX at 0x6A (SA0 low), aux pins grounded; mount over H5.  BME280 at 0x76 on the slotted PCB tab.
sheet 3
- 6  NFC ANTENNA
- * C13/C14 tuned on the bench for the coil inductance (Nordic NFC antenna tuning guide).
- 7  EXPANSION, PROTECTION & TEST

# Board PCB2
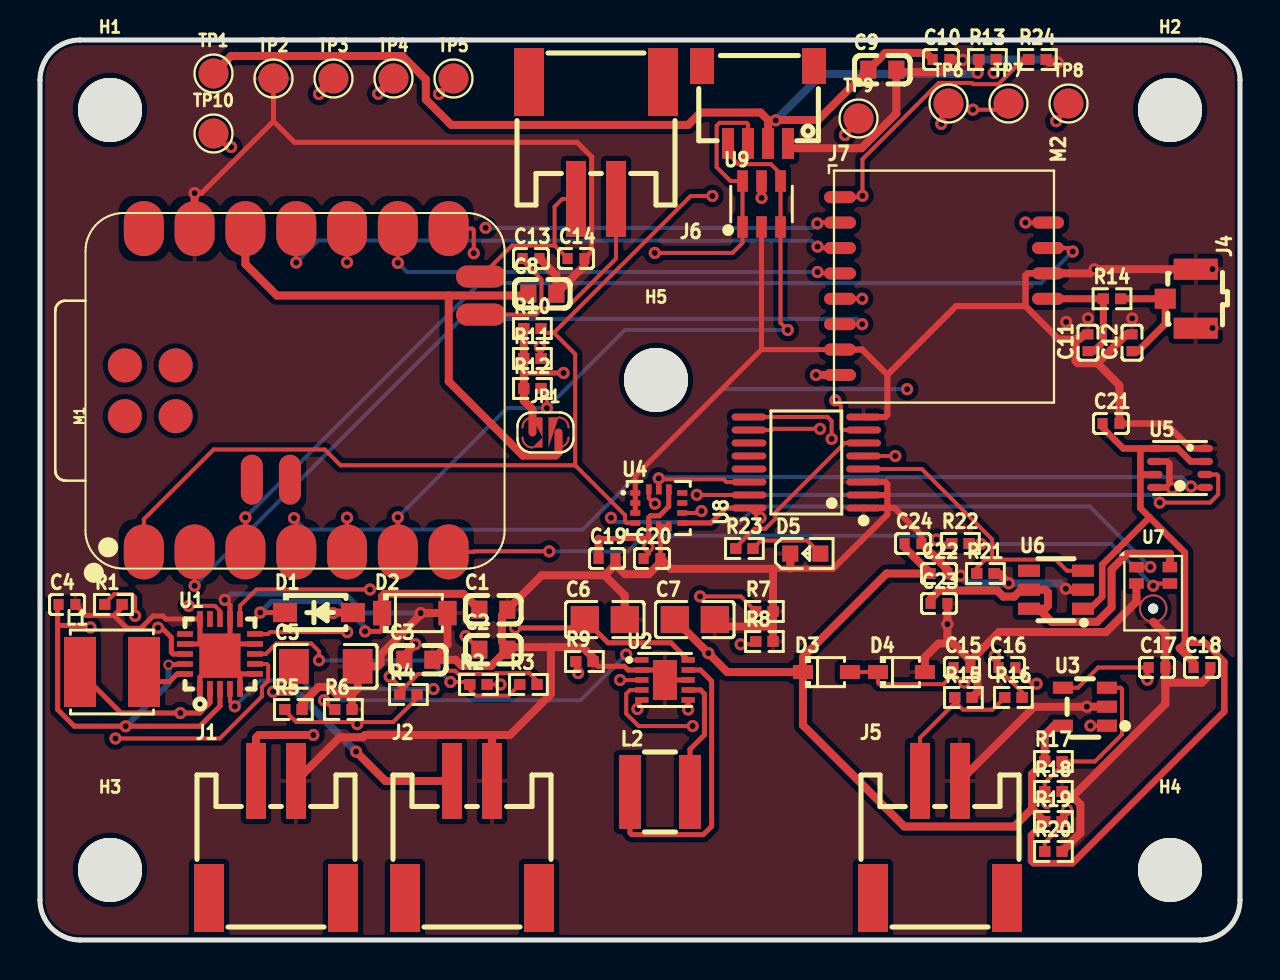
[diagram p3: board, top side]
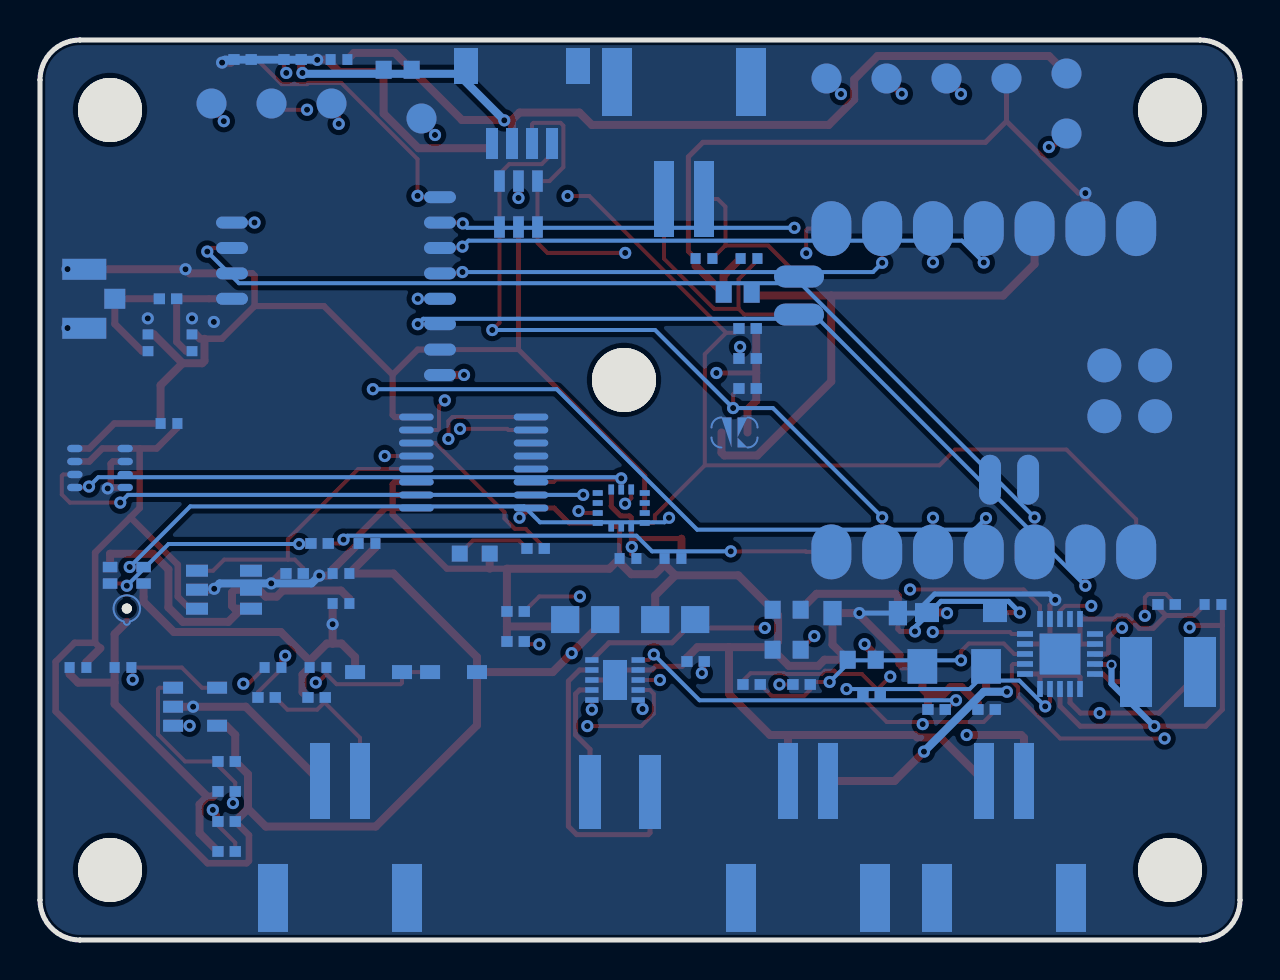
[diagram p4: board, bottom side, seen from below]

Outline 60 x 45 mm; copper layers: Top Layer, Inner1 GND, Inner2 PWR-SIG, Bottom Layer. Coordinates in mm from the lower left corner of the outline.
Outline path: 0,43 0,2 arc(0.59,0.59) 2,0 58,0 arc(59.41,0.59) 60,2 60,43 arc(59.41,44.42) 58,45 2,45 arc(0.59,44.42) 0,43
Stack: Top Layer 0.035mm Outer layer thickness 1oz / Dielectric1 0.2104mm 7628 RC49% 8.6mil er 4.4 / Inner1 GND 0.0152mm Inner layer thickness / Dielectric2 1.065mm 1.1mm H/HOZ Copper er 4.43 / Inner2 PWR-SIG 0.0152mm Inner layer thickness / Dielectric3 0.2104mm 7628 RC49% 8.6mil er 4.4 / Bottom Layer 0.035mm Outer layer thickness 1oz

## Design rules (mm)
spacing copperThickness1oz (default): track to track 0.102, other pairs 0.152 to 0.3
spacing copperThickness2oz: track to track 0.203, other pairs 0.152 to 0.3
track width copperThickness1oz (default): min 0.127, default 0.2, max 2.54
track width copperThickness2oz: min 0.203, default 0.254, max 2.54
track width power: min 0.2, default 0.4, max 2.54
track width rf: min 0.3, default 0.35, max 0.6
differential pair differentialPair (default): width min 0.127, default 0.254, max 2.54; gap min 0.152, default 0.152
net GND uses power
net VSOL uses power
net VSTOR uses power
net VBAT uses power
net 3V3_AON uses power
net 3V3_XIAO uses power
net RF_MOD uses rf
net RF_ANT uses rf
net 3V3_MIC uses power
net VSOL_RAW uses power
net LBOOST uses power
net LX2 uses power
net LX1 uses power

## Placement (name value [footprint] x y rotation side)
C1  4.7uF  [C0603]  22.67 16.51 0 top
C2  10nF  [C0603]  22.67 14.51 0 top
C3  4.7uF  [C0603]  18.92 14.01 0 top
C4  100nF  [C0402]  1.35 16.78 0 top
C5  100uF  [C1206]  14.29 13.68 0 top
C6  22uF  [C0805]  28.24 16.02 0 top
C7  22uF  [C0805]  32.74 16.02 0 top
C8  10uF  [C0603]  25.12 32.31 0 top
C9  10uF  [C0603]  42.12 43.51 0 top
C10  100nF  [C0402]  45.05 44.03 0 top
C11  DNP  [C0402]  52.4 29.86 90 top
C12  DNP  [C0402]  54.6 29.86 90 top
C13  300pF  [C0402]  24.55 34.08 0 top
C14  300pF  [C0402]  26.8 34.08 0 top
C15  4.7nF  [C0402]  46.1 13.62 0 top
C16  680pF  [C0402]  48.35 13.62 0 top
C17  10nF  [C0402]  55.85 13.62 0 top
C18  100nF  [C0402]  58.1 13.62 0 top
C19  100nF  [C0402]  28.35 19.08 0 top
C20  1uF  [C0402]  30.6 19.08 0 top
C21  100nF  [C0402]  53.55 25.83 0 top
C22  100nF  [C0402]  44.95 18.33 0 top
C23  100nF  [C0402]  44.95 16.83 0 top
C24  100nF  [C0402]  43.65 19.83 0 top
D1  -  [SOD-123_L2.7-W1.6-LS3.7-RD-1]  13.95 16.37 0 top
D2  -  [SOD-123_L2.7-W1.6-LS3.7-RD]  18.74 16.35 0 top
D3  -  [SOD-323_L1.8-W1.3-LS2.5-RD]  39.32 13.4 0 top
D4  -  [SOD-323_L1.8-W1.3-LS2.5-RD]  43.07 13.4 0 top
D5  -  [LED0603-RD]  38.26 19.32 0 top
H1  M3  [MountingHole_3.2mm_M3]  3.5 41.5 0 top
H2  M3  [MountingHole_3.2mm_M3]  56.5 41.5 0 top
H3  M3  [MountingHole_3.2mm_M3]  3.5 3.5 0 top
H4  M3  [MountingHole_3.2mm_M3]  56.5 3.5 0 top
H5  M3  [MountingHole_3.2mm_M3]  30.8 28 0 top
J1  -  [CONN-SMD_P2.00_S2B-PH-SM4-TB-LF-SN]  11.8 5.03 0 top
J2  -  [CONN-SMD_P2.00_S2B-PH-SM4-TB-LF-SN]  21.6 5.03 0 top
J4  6GHz  [RF-SMD_FRF05002-JSS103M]  57.02 32.06 270 top
J5  -  [CONN-SMD_P2.00_S2B-PH-SM4-TB-LF-SN]  45 5.03 0 top
J6  Conn_01x02  [CONN-SMD_P2.00_S2B-PH-SM4-TB-LF-SN]  27.8 39.98 180 top
J7  -  [CONN-SMD_4P-P1.00_SM04B-SRSS-TB-LF-SN]  35.9 41.76 180 top
JP1  BATT/USB  [SolderJumper-2_P1.3mm_Open_RoundedPad1.0x1.5mm]  25.28 25.38 0 top
L1  22uH  [IND-SMD_L4.0-W4.0]  3.6 13.4 0 top
L2  2.2uH  [IND-SMD_ANR4018T3R3M]  31 7.4 0 top
M1  Seeed XIAO nRF52840  [XIAO_nRF52840_SMD]  23.31 18.57 90 top
M2  Wio-SX1262-N  [Module:MODULE12P-1.27-11X11.6MM]  39.7 38.47 270 top
R1  6.65MΩ  [R0402]  3.67 16.78 0 top
R2  6.2MΩ  [R0402]  21.92 12.78 0 top
R3  1.13MΩ  [R0402]  24.42 12.78 0 top
R4  6.65MΩ  [R0402]  18.42 12.28 0 top
R5  5.11MΩ  [R0402]  12.67 11.53 0 top
R6  10MΩ  [R0402]  15.17 11.53 0 top
R7  36.5kΩ  [R0402]  36.22 16.43 0 top
R8  0Ω  [R0402]  36.22 14.93 0 top
R9  16.2kΩ  [R0402]  27.22 13.93 0 top
R10  100kΩ  [R0402]  24.62 30.58 0 top
R11  4.7kΩ  [R0402]  24.62 29.08 0 top
R12  4.7kΩ  [R0402]  24.62 27.58 0 top
R13  10kΩ  [R0402]  47.37 44.03 0 top
R14  0Ω  [R0402]  53.6 32.06 0 top
R15  1MΩ  [R0402]  46.17 12.13 0 top
R16  100kΩ  [R0402]  48.67 12.13 0 top
R17  10MΩ  [R0402]  50.67 8.93 0 top
R18  10MΩ  [R0402]  50.67 7.43 0 top
R19  10MΩ  [R0402]  50.67 5.93 0 top
R20  9.1MΩ  [R0402]  50.67 4.43 0 top
R21  1MΩ  [R0402]  47.27 18.33 0 top
R22  33Ω  [R0402]  46.02 19.83 0 top
R23  1kΩ  [R0402]  35.22 19.58 0 top
R24  100kΩ  [R0402]  49.87 44.03 0 top
TP1  3V3_AON  [TestPoint_Pad_D1.5mm]  8.67 43.33 0 top
TP2  GND  [TestPoint_Pad_D1.5mm]  11.67 43.08 0 top
TP3  VBAT  [TestPoint_Pad_D1.5mm]  14.67 43.08 0 top
TP4  VSOL  [TestPoint_Pad_D1.5mm]  17.67 43.08 0 top
TP5  VSTOR  [TestPoint_Pad_D1.5mm]  20.67 43.08 0 top
TP6  WAKE_N  [TestPoint_Pad_D1.5mm]  45.42 41.83 0 top
TP7  IMU_INT2  [TestPoint_Pad_D1.5mm]  48.42 41.83 0 top
TP8  EXP_P4  [TestPoint_Pad_D1.5mm]  51.42 41.83 0 top
TP9  EXP_P3  [TestPoint_Pad_D1.5mm]  40.92 41.08 0 top
TP10  VBAT_OK  [TestPoint_Pad_D1.5mm]  8.67 40.33 0 top
U1  -  [VQFN-20_L3.5-W3.5-P0.50-BL-EP2.0]  9 14.3 0 top
U2  -  [WSON-10_L2.5-W2.5-W0.50-TL-EP]  31.25 13 0 top
U3  TLV7041DBV  [SOT-23-5_L2.9-W1.6-P0.95-LS2.8-BR]  52.25 11.66 0 top
U4  -  [LGA-14L_L3.0-W2.5-P0.50-TL]  30.94 21.6 0 top
U5  BME280  [LGA-8_BME280_BL]  57 23.6 0 top
U6  -  [SOT-23-6_L2.9-W1.6-P0.95-LS2.8-BR]  50.8 17.52 0 top
U7  SPH0641LU4H-1  [Knowles_LGA-5_3.5x2.65mm]  55.66 17.34 0 top
U8  -  [TSSOP-16_L5.0-W4.4-P0.65-LS6.4-BL]  38.32 23.87 90 top
U9  USBLC6-2SC6  [SOT-23-6_L2.9-W1.6-P0.95-LS2.8-BL]  36.08 36.8 0 top

## Footprints (pads in the part's own frame, mm; a bottom-side part is the same pattern mirrored in y, then rotated)
C0402
  rect 0.5x0.54 hole 0.001: 1(-0.42,0) 2(0.42,0)
C0603
  rect 0.8x0.9 hole 0.001: 1(-0.7,0) 2(0.7,0)
C0805
  rect 1.41x1.35 hole 0.001: 1(-1,0) 2(1,0)
C1206
  rect 1.485x1.728 hole 0.001: 1(-1.593,0) 2(1.593,0)
CONN-SMD_4P-P1.00_SM04B-SRSS-TB-LF-SN
  rect 0.6x1.55 hole 0.001: 1(-1.5,1.938) 2(-0.5,1.938) 3(0.5,1.938) 4(1.5,1.938)
  rect 1.2x1.8 hole 0.001: 5(2.8,-1.938) 6(-2.8,-1.938)
CONN-SMD_P2.00_S2B-PH-SM4-TB-LF-SN
  rect 1x3.8 hole 0.001: 1(-1,2.925) 2(1,2.925)
  rect 1.5x3.4 hole 0.001: 3(3.35,-2.925) 4(-3.35,-2.925)
IND-SMD_ANR4018T3R3M
  rect 1.1x3.7 hole 0.001: 1(-1.5,0) 2(1.5,0)
IND-SMD_L4.0-W4.0
  rect 1.6x3.5 hole 0.001: 1(-1.6,0) 2(1.6,0)
Knowles_LGA-5_3.5x2.65mm
  round 0.5 hole 0.5: (0,-0.77)
  rect 0.725x0.522 hole 0.001: 1(-0.838,1.304) 2(-0.838,0.482) 4(0.838,0.482) 5(0.838,1.304)
  custom 1.325x1.475 hole 0.001: 3(0,-1.433)
LED0603-RD
  rect 0.8x0.8 hole 0.001: 1(-0.749,0) 2(0.749,0)
LGA-8_BME280_BL
  oval 0.767x0.364 hole 0.001: 1(1.258,0.975) 2(1.258,0.325) 3(1.258,-0.325) 4(1.258,-0.975) 5(-1.258,-0.975) 6(-1.258,-0.325) 7(-1.258,0.325) 8(-1.258,0.975)
LGA-14L_L3.0-W2.5-P0.50-TL
  rect 0.5x0.28 hole 0.001: 1(-1.175,0.75) 2(-1.175,0.25) 3(-1.175,-0.25) 4(-1.175,-0.75) 8(1.175,-0.75) 9(1.175,-0.25) 10(1.175,0.25) 11(1.175,0.75)
  rect 0.28x0.5 hole 0.001: 5(-0.5,-0.925) 6(0,-0.925) 7(0.5,-0.925) 12(0.5,0.925) 13(0,0.925) 14(-0.5,0.925)
Module:MODULE12P-1.27-11X11.6MM
  rrect 0.6x1.6 hole 0.001: 1(1.33,0.3) 2(2.6,0.3) 3(3.87,0.3) 4(5.14,0.3) 5(6.41,0.3) 6(7.68,0.3) 7(8.95,0.3) 8(10.22,0.3) 9(6.41,10.7) 10(5.14,10.7) 11(3.87,10.7) 12(2.6,10.7)
MountingHole_3.2mm_M3
  round 3.2 hole 3.2: (0,0)
R0402
  rect 0.566x0.54 hole 0.001: 1(-0.433,0) 2(0.433,0)
RF-SMD_FRF05002-JSS103M
  rect 1x1.05 hole 0.001: 1(0,-0.762)
  rect 1.05x2.2 hole 0.001: 2(-1.475,0.762) 3(1.475,0.762)
SOD-123_L2.7-W1.6-LS3.7-RD
  rect 0.91x1.22 hole 0.001: 1(-1.635,0) 2(1.635,0)
SOD-123_L2.7-W1.6-LS3.7-RD-1
  rect 1.2x0.95 hole 0.001: 1(-1.7,0) 2(1.7,0)
SOD-323_L1.8-W1.3-LS2.5-RD
  rect 1x0.7 hole 0.001: 1(-1.173,0) 2(1.173,0)
SolderJumper-2_P1.3mm_Open_RoundedPad1.0x1.5mm
  custom 1x1.5 hole 0.001: 1(-0.65,0) 2(0.65,0)
SOT-23-5_L2.9-W1.6-P0.95-LS2.8-BR
  rect 1x0.6 hole 0.001: 1(1.1,-0.95) 2(1.1,0) 3(1.1,0.95) 4(-1.1,0.95) 5(-1.1,-0.95)
SOT-23-6_L2.9-W1.6-P0.95-LS2.8-BL
  rect 0.532x1.072 hole 0.001: 1(-0.95,-1.149) 2(0,-1.149) 3(0.95,-1.149) 4(0.95,1.149) 5(0,1.149) 6(-0.95,1.149)
SOT-23-6_L2.9-W1.6-P0.95-LS2.8-BR
  rect 1.1x0.6 hole 0.001: 1(1.35,-0.95) 2(1.35,0) 3(1.35,0.95) 4(-1.35,0.95) 5(-1.35,0) 6(-1.35,-0.95)
TestPoint_Pad_D1.5mm
  round 1.5 hole 0.001: 1(0,0)
TSSOP-16_L5.0-W4.4-P0.65-LS6.4-BL
  oval 0.343x1.732 hole 0.001: 1(-2.275,-2.866) 2(-1.625,-2.866) 3(-0.975,-2.866) 4(-0.325,-2.866) 5(0.325,-2.866) 6(0.975,-2.866) 7(1.625,-2.866) 8(2.275,-2.866) 9(2.275,2.866) 10(1.625,2.866) 11(0.975,2.866) 12(0.325,2.866) 13(-0.325,2.866) 14(-0.975,2.866) 15(-1.625,2.866) 16(-2.275,2.866)
VQFN-20_L3.5-W3.5-P0.50-BL-EP2.0
  rect 0.28x0.8 hole 0.001: 1(-1.001,-1.751) 2(-0.501,-1.751) 3(-0.001,-1.751) 4(0.499,-1.751) 5(1,-1.749) 11(0.999,1.749) 12(0.501,1.751) 13(-0.001,1.749) 14(-0.501,1.749) 15(-1.001,1.749)
  rect 0.8x0.28 hole 0.001: 6(1.75,-0.999) 7(1.75,-0.499) 8(1.75,0.001) 9(1.75,0.501) 10(1.75,1.001) 16(-1.75,0.999) 17(-1.75,0.499) 18(-1.75,-0.001) 19(-1.75,-0.501) 20(-1.75,-1.001)
  rect 2.05x2.05 hole 0.001: 21(-0.001,-0.001)
WSON-10_L2.5-W2.5-W0.50-TL-EP
  rect 0.665x0.28 hole 0.001: 1(-1.157,1) 2(-1.157,0.5) 3(-1.157,0) 4(-1.157,-0.5) 5(-1.157,-1) 6(1.157,-1) 7(1.157,-0.5) 8(1.157,0) 9(1.157,0.5) 10(1.157,1)
  rect 1.2x2 hole 0.001: 11(0,0)
XIAO_nRF52840_SMD
  rrect 2.75x2 hole 0.001: 1(0.835,18.12) 2(0.835,15.58) 3(0.835,13.04) 4(0.835,10.5) 5(0.835,7.96) 6(0.835,5.42) 7(0.835,2.88) 8(17,2.88) 9(17,5.42) 10(17,7.96) 11(17,10.5) 12(17,13.04) 13(17,15.58) 14(17,18.12)
  rrect 1.1x2.5 hole 0.001: 15(12.7,1.263) 16(14.605,1.263)
  rrect 2.5x1.1 hole 0.001: 17(4.445,10.813) 18(4.445,12.719)
  round 1.7 hole 0.001: 19(7.62,19.069) 20(10.16,19.069) 21(7.62,16.529) 22(10.16,16.529)

## Nets
As in the schematic.

Pads without a net: J1 3 4; J2 3 4; J5 3 4; J6 3 4; J7 5 6; M1 14 17 18 19 20 21 22; U1 14 16; U4 10 11; U6 4; U8 11 12 13

## Via types
v1: diameter 0.61, hole 0.305, Top Layer to Bottom Layer, 115 vias
v2: diameter 0.508, hole 0.305, Top Layer to Bottom Layer, 1 via

## Routing (per net, layer and track width the routed paths; a pad name or vN(x,y) marks a point on that pad's centre or on a via; arc(x,y) is an arc through that point)
3V3_AON: length 212.3
  Top Layer w0.251: C20.1 30.41,19.31 v1(30.41,19.65) 30.44,19.68 30.44,20.14 ; U2.6 v1(32.41,11.52) ; U8.16 34.29,21.6 33.54,20.85 U4.8 ; U4.12 31.44,21.68 30.97,21.21 30.53,21.21 30.44,21.12 U4.5 30.44,20.14 ; 30.44,20.14 30.36,20.07 27.93,20.07 ; 24.19,28.35 v1(26.18,28.35)
  Top Layer w0.308: U8.16 35.54,21.6 v1(36.03,21.12)
  Top Layer w0.327: 55.02,24.58 55.02,23.28 ; 55.02,24.58 54.17,24.58 53.13,25.61 C21.1 ; 55.02,24.58 U5.8 56.89,24.58 57.54,23.93 58.26,23.93 ; 55.02,23.28 55.02,21.59 55.48,21.13 ; 55.02,23.28 U5.6 ; 55.48,21.13 53.11,18.76 53.11,17.17 52.51,16.57 U6.1 ; 55.48,21.13 57.24,19.37 57.24,14.86 ; R19.1 49.55,5.24 49.55,3.95 49.67,3.84 51.62,3.84 59.22,11.43 59.22,13.91 58.27,14.86 57.24,14.86 ; 56.98,14.59 57.24,14.86
  Top Layer w0.4: v1(46.88,43.35) 46.94,43.41 R13.1 ; TP1.1 9.55,44.2 18.12,44.2 19.29,43.03 19.29,42.03 20.57,40.75 32.41,40.75 33.03,41.37 36.03,41.37 36.4,41 ; D3.1 38.15,10.74 43.21,5.67 48.71,5.67 49.6,6.56 ; D3.1 38.15,14.15 42.33,18.33 C22.1 43.23,19.62 C24.1 ; D3.1 34.36,13.4 v1(33.42,14.34) C7.1 ; 56.98,14.59 57.68,13.89 C18.1 ; JP1.1 24.63,26.53 24.19,26.96 R12.1 R10.1 ; 51.14,10.71 50.7,10.71 50.24,10.26 R17.1 49.6,8.29 49.6,6.56 ; J7.2 36.4,41 ; 36.4,41 36.79,41 ; 49.6,6.56 R19.1 ; 27.93,20.07 C19.1 ; U9.5 v1(36.08,37.1) ; C10.1 44.3,44.36 42.26,44.36 C9.1 38.9,41 36.79,41 ; 36.79,41 v1(36.79,40.98) ; M2.8 v1(38.8,28.25)
  Inner2 PWR-SIG w0.251: v1(32.41,11.52) 33.42,12.53 v1(33.42,14.34) 33.74,14.67 33.74,19.65 ; v1(30.41,19.65) 33.74,19.65 ; 33.74,19.65 34.56,19.65 v1(36.03,21.12) 36.03,25.48 v1(38.8,28.25) 36.08,30.98 v1(36.08,37.1) 27.31,28.34 26.2,28.34 v1(26.18,28.35)
  Inner2 PWR-SIG w0.4: v1(36.08,37.1) 36.08,40.27 v1(36.79,40.98)
  Bottom Layer w0.4: v1(36.79,40.98) 39.11,43.31 46.83,43.31 ; v1(46.88,43.35) 46.83,43.31
3V3_MIC: length 18.3
  Top Layer w0.4: U7.5 56.5,19.31 56.49,19.31 54.36,19.31 53.58,18.53 53.58,16.63 52.86,15.91 50.58,15.91 49.92,16.57 ; 49.92,16.57 50.26,16.57 50.4,16.71 50.4,17.37 50.26,17.52 U6.5 49.06,17.52 48.71,17.17 48.17,17.17 47.86,17.47 44.95,17.47 44.53,17.05 C23.1 ; 49.92,16.57 U6.6
3V3_XIAO: length 29
  Top Layer w0.4: 20.44,32.22 11.84,32.22 10.27,33.8 M1.12 ; 20.44,32.22 24.33,32.22 C8.1 ; 20.44,32.22 20.44,27.92 24.14,24.23 25.78,24.23 25.92,24.37 25.92,25.38
GND: length 351.9
  Top Layer w0.251: 31.02,20.68 C20.2 ; 31.02,20.68 U4.6 ; 31.02,20.68 U4.7 ; 36.08,29.52 U9.2 ; 36.08,29.52 29.76,23.21 U4.1 U4.2 U4.3 ; 36.08,29.52 M2.7 40.12,29.52
  Top Layer w0.252: C14.2 27.58,34.44 27.58,39.16 26.85,39.88 12.73,39.88 11.67,40.94 ; 9.5,14.8 9.36,14.66 ; 9.5,14.8 9.36,14.66 ; 9.5,14.8 U1.12 9.5,16.73 9.24,17 v1(9.24,17.01) ; 9.5,14.8 U1.9 ; 9.36,14.66 U1.21 ; 27.65,13.93 27.89,13.69 29.22,13.69 29.4,13.5 U2.2 30.75,13.5 U2.11 U2.8 ; C4.2 2.32,16.23 3.7,16.23 ; v1(7.73,37.34) 8.08,37.34 11.67,40.94 ; U1.1 8,13.14 8.09,13.23 9.97,13.23 10,13.2 ; 3.7,16.23 4.34,15.58 5.04,15.58 5.66,16.2 6.14,16.2 6.29,16.05 U1.15 8,14.8 ; 3.7,16.23 4.1,16.63 R1.2 ; 8,14.8 8.5,14.8 U1.21 ; 8,14.8 7.25,14.8 ; 11.67,40.94 TP2.1 ; U1.21 10,13.3 10,13.3 ; 10,13.3 10,13.2 ; 10,13.3 U1.6 ; v1(19.03,16.35) 19.08,16.31 ; 10,13.2 U1.5
  Top Layer w0.308: 36.65,18.56 39.65,18.56 42.37,21.28 42.37,21.6 ; C24.2 44.07,20.25 42.72,21.6 42.37,21.6 ; 42.37,28.26 45.8,31.7 49.27,31.7 ; 42.37,28.26 42.37,26.26 42.26,26.15 U8.8 ; 42.37,28.26 41.11,29.52 40.12,29.52 ; 42.37,22.25 42.37,22.79 42.26,22.9 U8.3 ; 42.37,22.25 U8.2 ; 42.37,22.25 42.37,21.6 ; 42.37,21.6 U8.1
  Top Layer w0.327: C21.2 56.29,25.83 57.54,24.58 58.26,24.58 ; v1(56.61,22.58) 56.57,22.63 56.47,22.63 ; U5.5 56.47,22.63 ; 56.47,22.63 56.47,23.81 56.35,23.93 U5.7 ; 50.4,33.33 49.39,33.33 49.27,33.22 49.27,31.7 50.91,30.06 52,30.06
  Top Layer w0.4: 27.65,13.93 27.65,14.12 27.13,14.64 25.55,14.64 ; 42.82,43.4 45.03,43.4 45.47,43.84 C10.2 46.12,44.03 v1(46.14,44.01) ; 42.82,43.4 42.82,41.33 41.08,39.59 37.63,39.59 J7.1 ; 42.82,43.4 C9.2 ; 23.37,14.64 23.1,14.91 23.1,16.24 C1.2 25.09,18.23 28.23,18.23 ; 23.37,14.64 25.55,14.64 ; 23.37,14.64 C2.2 22.56,13.71 21.08,13.71 20.78,14.01 C3.2 20.38,14.77 20.38,16.35 19.12,16.35 19.08,16.31 17.02,14.25 17.02,13.82 16.88,13.68 C5.2 15.88,12.57 15.6,12.29 ; 22.6,10.25 16.26,10.25 16.14,10.13 14.98,10.13 J1.2 ; 22.6,10.25 J2.2 ; 22.6,10.25 23.5,10.25 25.55,12.3 25.55,14.64 ; v1(51.29,17.56) 51.34,17.52 U6.2 ; v1(48.44,17.83) 47.94,18.33 R21.2 ; J4.2 v1(52.73,33.54) 52.52,33.33 50.4,33.33 ; 51.63,7.17 51.36,7.17 R18.2 ; 51.63,7.17 52.02,6.78 52.02,5.34 R20.2 ; 51.63,7.17 56.27,11.8 56.27,12.87 ; 52.87,28.84 51.89,28.84 51.78,28.96 51.78,30.06 ; 52.87,28.84 54.31,30.28 C12.2 ; 52.87,28.84 53.97,27.74 C21.2 ; 28.23,18.23 29.24,17.22 C6.2 ; 28.23,18.23 28.77,18.77 ; 45.37,14.82 45.66,14.82 46.52,13.96 ; 45.37,14.82 C23.2 ; 45.37,14.82 44.92,14.82 44.25,14.15 D4.2 ; C13.2 25.82,33.23 C8.2 27.22,33.72 C14.2 ; v1(50.9,43.87) 50.46,43.87 R24.2 ; 28.77,18.77 29.25,18.29 30.43,18.29 31.02,18.88 C20.2 31.53,18.56 36.65,18.56 36.65,15.68 ; 28.77,18.77 C19.2 ; 36.65,15.68 34.08,15.68 C7.2 ; 36.65,15.68 36.65,14.93 ; 54.82,17.82 54.82,16.92 53.31,15.4 47.96,15.4 46.52,13.96 ; C24.2 45.37,18.53 C22.2 45.48,18.22 v1(46.03,18.22) ; M1.13 v1(7.73,37.34) ; R15.2 46.87,12.4 46.87,13.27 C15.2 46.52,13.96 ; 56.27,12.87 58.1,12.87 58.52,13.29 C18.2 ; 56.27,12.87 C17.2 56.27,15.3 U7.3 ; 15.6,12.29 14.83,12.29 14.48,12.65 13.93,12.65 13.1,11.82 R5.2 ; 15.6,12.29 R6.2 ; 37.52,18.56 D5.1 ; C11.2 52.22,30.28 52,30.06 ; J5.2 49.71,11.66 v1(52.34,11.66) U3.2
  Inner2 PWR-SIG w0.252: v1(7.73,37.34) 9.24,35.84 v1(9.24,17.01)
  Inner2 PWR-SIG w0.308: v1(52.34,11.66) 51.73,11.06 51.73,10.54 52.17,10.1 52.77,10.1 53.45,10.77 53.45,14.36
  Inner2 PWR-SIG w0.4: v1(50.9,43.87) 52.73,42.04 v1(52.73,33.54) 51.29,32.1 v1(51.29,17.56)
  Bottom Layer w0.252: v1(19.03,16.35) 16.22,16.35 15.27,17.3 9.53,17.3 v1(9.24,17.01)
  Bottom Layer w0.4: v1(51.29,17.56) 51.02,17.83 v1(48.44,17.83) 46.42,17.83 v1(46.03,18.22) ; v1(46.14,44.01) 46.14,44.02 50.75,44.02 v1(50.9,43.87)
  vias: v1(45.37,15.79) v1(51.31,30.9) v1(52.4,31.08) v1(54.61,31.08) v1(58.62,33.55) v1(58.62,30.6)
VBAT: length 75.4
  Top Layer w0.252: U2.10 31.55,14.86 28.4,14.86 C6.1 26.82,15.6 v1(23.76,15.6) ; v1(5.9,15.61) 6.08,15.61 6.57,15.13 6.57,14.39 6.66,14.3 7.25,14.3
  Top Layer w0.4: v1(15.8,9.42) 17.27,7.95 J2.1 ; 12.7,13.68 12.7,12.56 12.55,12.41 v1(11.66,12.41) ; TP3.1 13.95,42.35 v1(13.95,42.3)
  Inner2 PWR-SIG w0.252: v1(5.9,15.61) 9.29,15.61 10.73,17.05 13.95,17.05 ; v1(23.76,15.6) 23.76,15.25 17.93,9.42 v1(15.8,9.42)
  Inner2 PWR-SIG w0.4: v1(11.66,12.41) 11.79,12.55 11.79,17.05 ; v1(13.95,42.3) 13.95,17.05
  Bottom Layer w0.4: v1(15.8,9.42) 12.81,12.41 v1(11.66,12.41)
VBAT_OK: length 63.6
  Top Layer w0.2: U2.1 29.57,14 29.31,14.26 v1(29.31,14.27) ; TP10.1 9.35,39.65 v1(9.56,39.65) ; v1(14.2,11.99) 14.66,11.53 R6.1 ; v1(7.44,16.71) 8.75,16.71 9,16.45 U1.13
  Inner2 PWR-SIG w0.2: v1(9.56,39.65) 10.86,38.34 10.86,17.81 9.43,16.38 7.76,16.38 v1(7.44,16.71) 6.15,16.71 5.32,15.87 5.32,12.14 6.7,10.76 12.97,10.76 v1(14.2,11.99)
  Bottom Layer w0.2: v1(14.2,11.99) 27.02,11.99 v1(29.31,14.27)
VBAT_OV: length 42.1
  Top Layer w0.2: v1(3.77,10.08) 8.99,10.08 11.09,12.18 11.09,12.65 11.41,12.96 11.41,13.73 11.34,13.8 U1.7 ; v1(4.76,16.21) 4.76,17.13 4.58,17.3 3.71,17.3 3.24,16.83 R1.1 ; v1(23.03,12.78) 22.35,12.78
  Inner2 PWR-SIG w0.2: v1(4.76,16.21) 3.57,15.03 3.57,10.28 v1(3.77,10.08) 4.99,8.86 19.11,8.86 v1(23.03,12.78)
CFG1: length 10
  Top Layer w0.2: U2.3 v1(29,13) ; R7.1 35.04,17.18 v1(33.01,17.18)
  Inner2 PWR-SIG w0.2: v1(29,13) 29,13.18 v1(33.01,17.18)
CFG2: length 11.3
  Top Layer w0.2: v1(35.03,14.79) 35.65,14.79 R8.1 ; v1(32.64,10.7) 29.93,10.7 29.31,11.32 29.31,12.31 29.5,12.5 U2.4
  Inner2 PWR-SIG w0.2: v1(35.03,14.79) 35.03,13.1 v1(32.64,10.7)
CFG3: length 4.9
  Top Layer w0.2: R9.1 26.79,13.47 v1(26.91,13.35) ; U2.5 29.87,11.78 v1(29.87,11.55)
  Inner2 PWR-SIG w0.2: v1(26.91,13.35) 28.7,11.55 v1(29.87,11.55)
CMP_IN: length 16.7
  Top Layer w0.2: U3.3 54.03,12.61 54.1,12.54 54.1,10.28 52.75,8.93 R17.2 51.1,8.73 50.24,7.87 R18.1 50.35,7.31 v1(50.35,6.85) ; C16.2 49.58,12.81 v1(49.83,12.81)
  Inner2 PWR-SIG w0.2: v1(49.83,12.81) 50.35,12.3 v1(50.35,6.85)
CMP_REF: length 16.1
  Top Layer w0.2: v1(55.37,13.02) 55.37,13.56 C17.1 52.91,13.62 51.9,12.61 51.14,12.61 ; R20.1 50.24,4.87 51.1,5.73 R19.2 51.1,6.25 v1(51.36,6.51)
  Inner2 PWR-SIG w0.2: v1(51.36,6.51) 55.37,10.51 v1(55.37,13.02)
EN_MIC: length 14.9
  Top Layer w0.2: 47.61,19.02 47.61,20.03 44.09,23.55 U8.4 ; 47.61,19.02 47.26,19.02 46.84,18.6 R21.1 ; 47.61,19.02 50.79,19.02 51.34,18.47 U6.3
EXP_P3: length 17.3
  Top Layer w0.2: v1(39.76,26.98) 40.05,26.69 40.05,25.57 40.12,25.5 U8.7 ; TP9.1 40.92,40.93 v1(40.25,40.25)
  Inner2 PWR-SIG w0.2: v1(39.76,26.98) 39.76,39.76 v1(40.25,40.25)
EXP_P4: length 30.9
  Top Layer w0.2: U8.9 39.38,26.15 39.58,25.95 v1(39.58,25.05) ; v1(50.81,40.94) 51.42,41.56 TP8.1
  Inner2 PWR-SIG w0.2: v1(50.81,40.94) 50.81,31.43 42.88,23.5 41.13,23.5 v1(39.58,25.05)
I2C_SCL: length 77.4
  Top Layer w0.2: v1(30.94,23.08) 30.94,23.03 ; 30.94,23.03 34.18,23.03 34.32,22.9 U8.14 ; 30.94,23.03 U4.13 ; v1(57.55,22.67) 57.6,22.63 58.26,22.63 ; v1(37.39,30.5) 37.03,30.86 U9.3 U9.4 37.03,38.31 36.54,38.79 34.92,38.79 34.4,39.31 J7.4 ; v1(25.34,26.6) 25.34,27.29 25.05,27.58 ; M1.6 v1(17.89,21.13)
  Inner2 PWR-SIG w0.2: v1(30.94,23.08) 28.86,23.08 v1(25.34,26.6)
  Bottom Layer w0.2: v1(30.94,23.08) 31,23.14 57.08,23.14 v1(57.55,22.67) ; v1(37.39,30.5) 29.25,30.5 v1(25.34,26.6) 23.36,26.6 v1(17.89,21.13)
I2C_SDA: length 84.3
  Top Layer w0.2: v1(30.75,21.81) 30.71,21.81 30.44,22.09 U4.14 ; v1(55.99,21.87) 58.51,21.87 58.91,22.27 58.91,23.21 58.84,23.28 58.26,23.28 ; v1(32.84,22.26) 32.85,22.25 U8.15 ; 25.05,29.08 25.05,29.6 v1(25,29.66) ; J7.3 35.4,40.79 35.33,40.86 33.97,40.86 33.83,40.72 33.83,38.64 34.53,37.95 U9.6 U9.1 35.13,34.86 34.62,34.36 v1(30.74,34.36) ; M1.5 v1(15.35,21.11)
  Inner2 PWR-SIG w0.2: 29.11,21.81 29.11,20.85 28.79,20.53 15.93,20.53 v1(15.35,21.11) ; 29.11,21.81 24.64,26.28 24.64,29.3 v1(25,29.66) 26.04,29.66 v1(30.74,34.36) ; 29.11,21.81 v1(30.75,21.81) 31.19,22.26 v1(32.84,22.26)
  Bottom Layer w0.2: v1(32.84,22.26) 55.6,22.26 v1(55.99,21.87)
IMU_INT2: length 43.4
  Top Layer w0.2: U4.9 32.98,21.35 v1(33.07,21.45) ; TP7.1 48.11,41.52 v1(46.65,41.52)
  Inner2 PWR-SIG w0.2: v1(46.65,41.52) 46.14,42.02 36.53,42.02 32.81,38.31 32.81,35.49 31.09,33.77 30.61,33.77 25.56,28.72 25.56,28.18 25.97,27.76 28.26,27.76 33.48,22.54 33.48,21.85 v1(33.07,21.45)
LBOOST: length 1.8
  Top Layer w0.252: 5.59,12.92 6.48,12.92 6.86,13.3 7.25,13.3
LED_A: length 3.8
  Top Layer w0.2: 35.65,19.58 36.05,19.97 38.36,19.97 D5.2
LED_DRV: length 8.8
  Top Layer w0.2: R23.1 34.79,19.63 35.71,20.56 36.26,20.56 36.78,21.08 36.78,21.39 40.24,24.85 U8.6
LORA_BUSY: length 49.9
  Top Layer w0.2: M1.3 v1(10.27,21.13) ; M2.11 51.46,34.6 v1(51.64,34.42)
  Bottom Layer w0.2: v1(10.27,21.13) 21.98,32.84 50.05,32.84 v1(51.64,34.42)
LORA_DIO1: length 47.4
  Top Layer w0.2: M1.4 12.81,20.99 v1(12.7,21.1) ; M2.12 v1(49.28,35.87)
  Inner2 PWR-SIG w0.2: v1(49.28,35.87) 49.28,33.46 v1(43.36,27.54)
  Bottom Layer w0.2: v1(12.7,21.1) 13.28,20.52 27.14,20.52 34.16,27.54 v1(43.36,27.54)
LORA_NRST: length 26
  Top Layer w0.2: v1(47.69,43.35) 47.8,43.47 R13.2 ; U8.5 v1(42.76,24.2) ; v1(41.11,32.06) M2.5
  Inner2 PWR-SIG w0.2: v1(47.69,43.35) 47.69,38.64 v1(41.11,32.06) 42.76,30.41 v1(42.76,24.2)
LORA_NSS: length 41.8
  Top Layer w0.2: v1(41.11,30.79) 40,30.79 ; M1.2 v1(7.73,17.71)
  Bottom Layer w0.2: v1(7.73,17.71) 21.08,31.06 40.84,31.06 v1(41.11,30.79)
LORA_RXEN: length 29.6
  Top Layer w0.2: v1(39,25.56) 36.64,25.56 36.58,25.5 U8.10 ; R24.1 49.15,44.03 47.92,42.79 46.65,42.79 46.59,42.85 44.93,42.85 41.12,39.04 v1(41.12,37.21) 41.06,37.14 M2.1
  Inner2 PWR-SIG w0.2: v1(39,25.56) 39.13,25.56 40.32,26.75 40.32,36.41 v1(41.12,37.21)
LX1: length 15
  Top Layer w0.252: L2.1 29.5,5.36 29.59,5.27 33.17,5.27 33.58,5.68 33.58,12.94 33.02,13.5 U2.9
LX2: length 6.1
  Top Layer w0.251: U2.7 33.02,12.5 33.22,12.3 33.22,10.25 32.5,9.53 L2.2
NFC1: length 13.8
  Top Layer w0.2: J6.1 28.8,34.07 26.3,31.56 25.07,31.56 ; 25.07,31.56 24.78,31.27 M1.15 ; 25.07,31.56 25.07,33.03 24.13,33.97 C13.1
NFC2: length 8.4
  Top Layer w0.2: M1.16 23.6,34.73 25.73,34.73 ; C14.1 25.73,34.73 ; 25.73,34.73 25.73,36.67 26.11,37.05 J6.2
OK_HYST: length 16.5
  Top Layer w0.2: 17.99,12.28 17.99,12.38 18.13,12.53 ; v1(15.36,15.4) 11.5,15.4 11.41,15.3 U1.10 ; R3.2 24.85,12.96 24.48,13.34 22.8,13.34 22.76,13.3 20.91,13.3 20.75,13.46 20.29,13.46 20.13,13.3 18.91,13.3 18.13,12.53 ; 18.13,12.53 v1(17.49,13.17)
  Inner2 PWR-SIG w0.2: v1(17.49,13.17) 15.36,15.3 v1(15.36,15.4)
OK_PROG: length 23.5
  Top Layer w0.2: v1(16.5,17.53) 10.82,17.53 10,16.71 U1.11 ; 18.85,12.28 18.85,12.09 17.66,10.9 15.86,10.9 ; R5.1 12.24,11.48 12.81,10.9 15.86,10.9 ; 15.86,10.9 v1(15.86,10.79)
  Inner2 PWR-SIG w0.2: v1(15.86,10.79) 15.9,10.79 18.05,12.94 18.05,15.98 v1(16.5,17.53)
PDM_CLK: length 11
  Top Layer w0.2: R22.2 46.48,19.8 v1(47.05,19.8) ; 56.5,17.82 55.77,17.82 v1(55.66,17.71)
  Bottom Layer w0.2: v1(55.66,17.71) 53.57,19.8 v1(47.05,19.8)
PDM_CLK_MCU: length 25.7
  Top Layer w0.2: R22.1 45.02,19.83 v1(44.82,20.02) ; v1(25.46,19.43) 21.72,19.43 21.69,19.41 M1.7
  Bottom Layer w0.2: v1(44.82,20.02) 44.63,20.22 30.18,20.22 29.4,19.43 v1(25.46,19.43)
PDM_DAT: length 47.9
  Top Layer w0.2: M1.8 21.62,35.57 21.69,35.5 v1(21.69,34.34) ; v1(55.52,18.65) 55.51,18.65 U7.1
  Inner2 PWR-SIG w0.2: v1(28.55,21.11) 21.69,27.97 v1(21.69,34.34)
  Bottom Layer w0.2: v1(28.55,21.11) 28.77,20.89 35,20.89 35.79,21.68 52.49,21.68 v1(55.52,18.65)
PIEZO: length 7.8
  Top Layer w0.2: R15.1 45.74,11.92 45.78,11.88 ; J5.1 44,10.11 45.78,11.88 ; 45.78,11.88 46.14,11.52 47.63,11.52 R16.1
PZ_LP: length 11.7
  Top Layer w0.2: 45.68,13.3 C15.1 ; 45.68,13.3 45.17,12.79 41.97,12.79 41.9,12.86 D4.1 D3.2 ; 45.68,13.3 46.1,12.88 v1(46.21,12.88) ; v1(47.74,14.21) 47.93,14.02 C16.1 47.93,13.56 49.1,12.39 R16.2
  Inner2 PWR-SIG w0.2: v1(47.74,14.21) 47.55,14.21 v1(46.21,12.88)
RF_ANT: length 5.7
  Top Layer w0.35: C12.1 54.9,29.44 56.26,30.8 J4.1 R14.2
RF_MOD: length 5.9
  Top Layer w0.35: M2.9 51.55,32.06 R14.1 53.17,29.91 52.7,29.44 C11.1
SPI_MISO: length 27.2
  Top Layer w0.2: M1.10 v1(15.35,33.89) ; M2.2 38.94,35.87 38.9,35.83 v1(38.86,35.83)
  Inner2 PWR-SIG w0.2: v1(15.35,33.89) 17.08,35.61 v1(22.28,35.61)
  Bottom Layer w0.2: v1(22.28,35.61) 38.65,35.61 v1(38.86,35.83)
SPI_MOSI: length 29.5
  Top Layer w0.2: M2.3 38.94,34.6 v1(38.88,34.67) ; M1.11 v1(12.81,33.87)
  Bottom Layer w0.2: v1(12.81,33.87) 13.91,34.97 38.58,34.97 v1(38.88,34.67)
SPI_SCK: length 24
  Top Layer w0.2: M1.9 v1(17.89,33.86) ; v1(38.88,33.4) 38.94,33.33 40,33.33
  Bottom Layer w0.2: v1(17.89,33.86) 18.35,33.4 v1(38.88,33.4)
VRDIV: length 15.2
  Top Layer w0.2: R3.1 23.43,12.22 21.79,12.22 21.49,12.51 R2.1 21.36,12.9 v1(20.52,12.9) ; v1(13.95,13.98) 13.95,14.44 13.56,14.82 11.81,14.82 11.29,14.3 U1.8
  Bottom Layer w0.2: v1(20.52,12.9) 19.44,13.98 v1(13.95,13.98)
VREF_SAMP: length 15.9
  Top Layer w0.2: C2.1 v1(21.29,15.2) ; v1(9.74,11.68) 9.5,11.92 U1.4
  Inner2 PWR-SIG w0.2: v1(21.29,15.2) 19.67,13.58 v1(19.67,12.55)
  Bottom Layer w0.2: v1(9.74,11.68) 11.03,12.97 13.09,12.97 13.52,12.55 v1(19.67,12.55)
VSOL: length 59.7
  Top Layer w0.252: D2.1 17.11,15.54 16.99,15.43 v1(16.25,15.43) ; U1.2 8.5,11.87 7.98,11.35 v1(7.02,11.35) 4.05,11.35 L1.1 ; D1.1 v1(11.01,16.37)
  Top Layer w0.4: C1.1 21.17,17.31 17.22,17.31 17.11,17.19 D2.1 ; TP4.1 v1(16.91,42.31)
  Inner2 PWR-SIG w0.252: v1(16.91,42.31) 14.7,40.1 14.7,18.89 15.91,17.67 15.91,15.77 v1(16.25,15.43) ; v1(11.01,16.37) 7.02,12.38 7.02,11.35
  Bottom Layer w0.252: v1(16.25,15.43) 16.25,15.63 14.95,16.93 11.57,16.93 v1(11.01,16.37)
VSOL_RAW: length 12.8
  Top Layer w0.4: J1.1 10.8,10.11 10.94,10.25 v1(13.67,10.25) ; D1.2 14.68,16.37 v1(14.65,16.34)
  Inner2 PWR-SIG w0.4: v1(14.65,16.34) 14.65,12.47 14.86,12.26 14.86,11.45 v1(13.67,10.25)
VSTOR: length 81.3
  Top Layer w0.252: TP5.1 20.67,43.02 v1(19.95,42.3) ; 0.88,15.73 0.88,16.73 C4.1 ; 0.88,15.73 0.88,11.52 1.72,10.69 v1(4.28,10.69) 7.99,10.69 9,11.7 U1.3 ; 0.88,15.73 2.42,15.73 v1(2.52,15.63) ; 7.25,13.8 v2(6.43,13.76)
  Top Layer w0.4: v1(18.77,14.79) 18.22,14.24 18.22,14.01
  Inner2 PWR-SIG w0.252: v1(2.52,15.63) 2.52,33.54 12.02,43.04 19.21,43.04 v1(19.95,42.3) ; v1(4.28,10.69) 5.31,9.66 15.22,9.66 15.56,10.01 15.93,10.01 18.77,12.85 v1(18.77,14.79)
  Bottom Layer w0.305: v2(6.43,13.76) 6.43,12.82 4.29,10.69
WAKE_N: length 102.2
  Top Layer w0.2: 25.05,30.58 25.27,30.36 25.69,30.36 ; 45.06,40.81 45.06,41.46 TP6.1 ; 26.76,23.73 15.03,23.73 14.24,24.52 8.68,24.52 5.19,21.04 M1.1 ; 26.76,23.73 26.76,29.29 25.69,30.36 ; 26.76,23.73 29.26,21.24 29.26,20.92 29.33,20.85 U4.4 ; 25.69,30.36 32.53,37.2 v1(33.62,37.2) ; U3.1 v1(52.52,10.71)
  Inner2 PWR-SIG w0.2: 39.43,41.01 44.86,41.01 v1(45.06,40.81) ; 39.43,41.01 39.43,27.92 38.38,26.88 38.38,24.98 48.31,15.05 49.93,15.05 52.9,12.08 52.9,11.1 v1(52.52,10.71) ; 39.43,41.01 38.83,41.61 36.62,41.61 33.62,38.61 v1(33.62,37.2)

## Copper pours and planes (outline as drawn; the poured copper is in the pictures)
GND on Top Layer: 0.25,44.75 59.74,44.75 59.74,0.25 0.25,0.25
GND on Bottom Layer: 0.25,44.75 59.74,44.75 59.74,0.25 0.25,0.25
GND on Inner1 GND: 0.25,44.75 59.74,44.75 59.74,0.25 0.25,0.25
